# Altium schematic sheet PCB-MAIN.SchDoc
size 594 x 420 mm
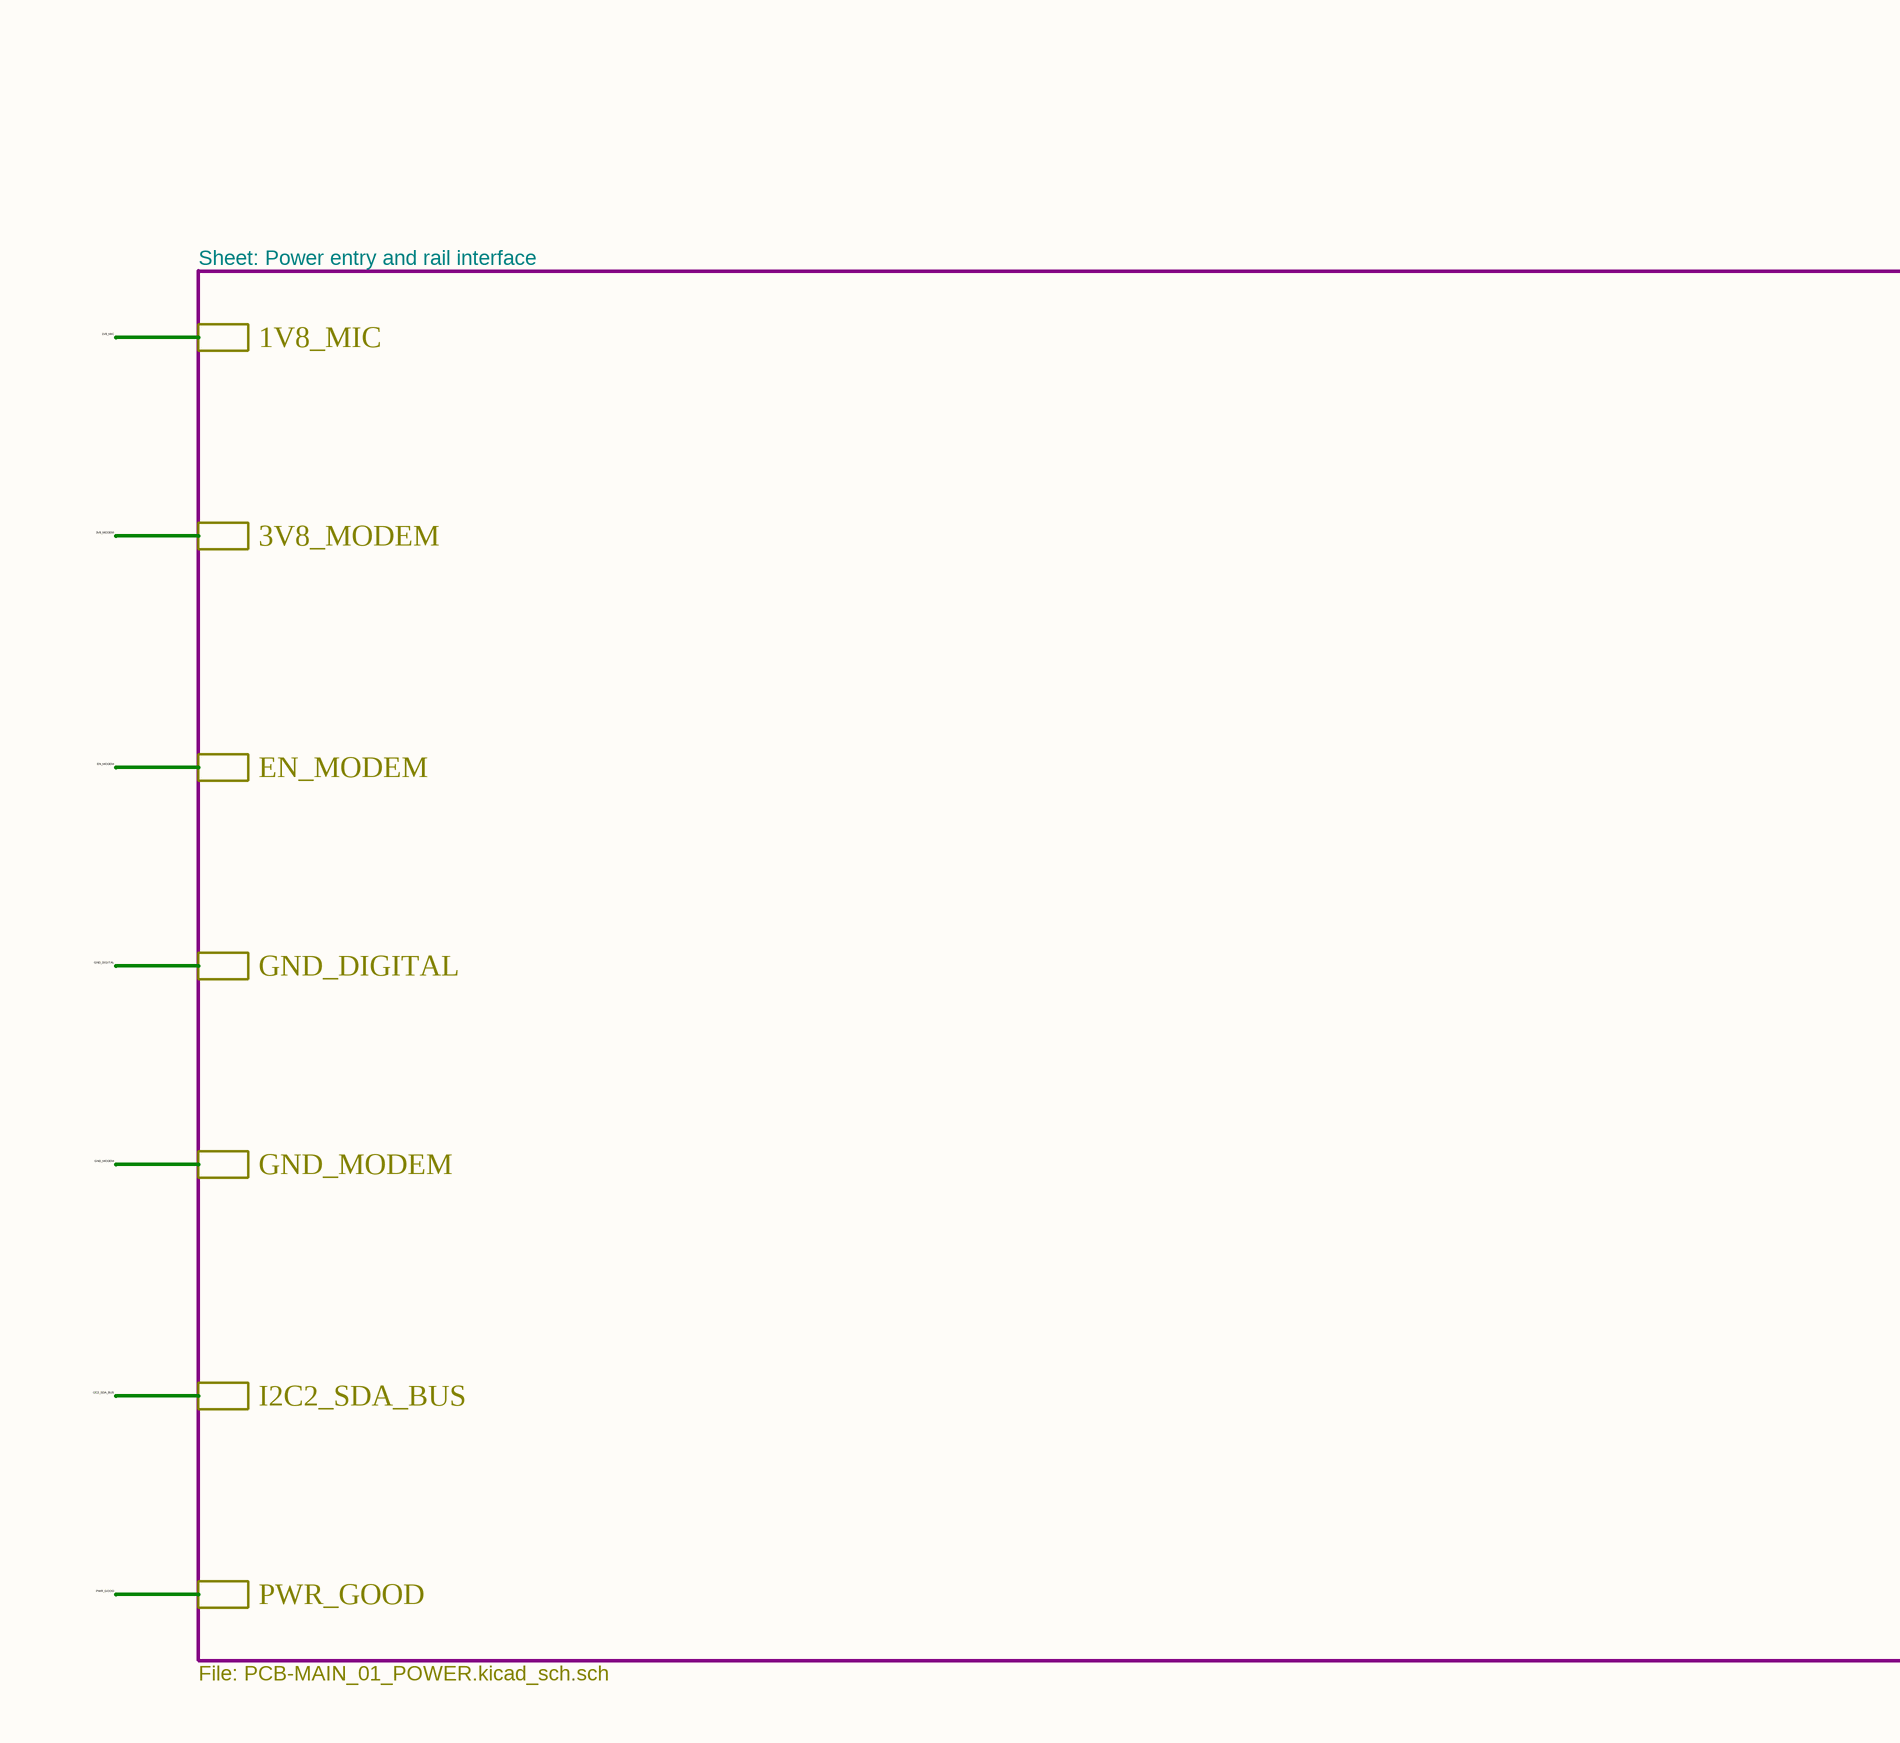
[diagram p0: PCB-MAIN.SchDoc, top column 1 of 4]
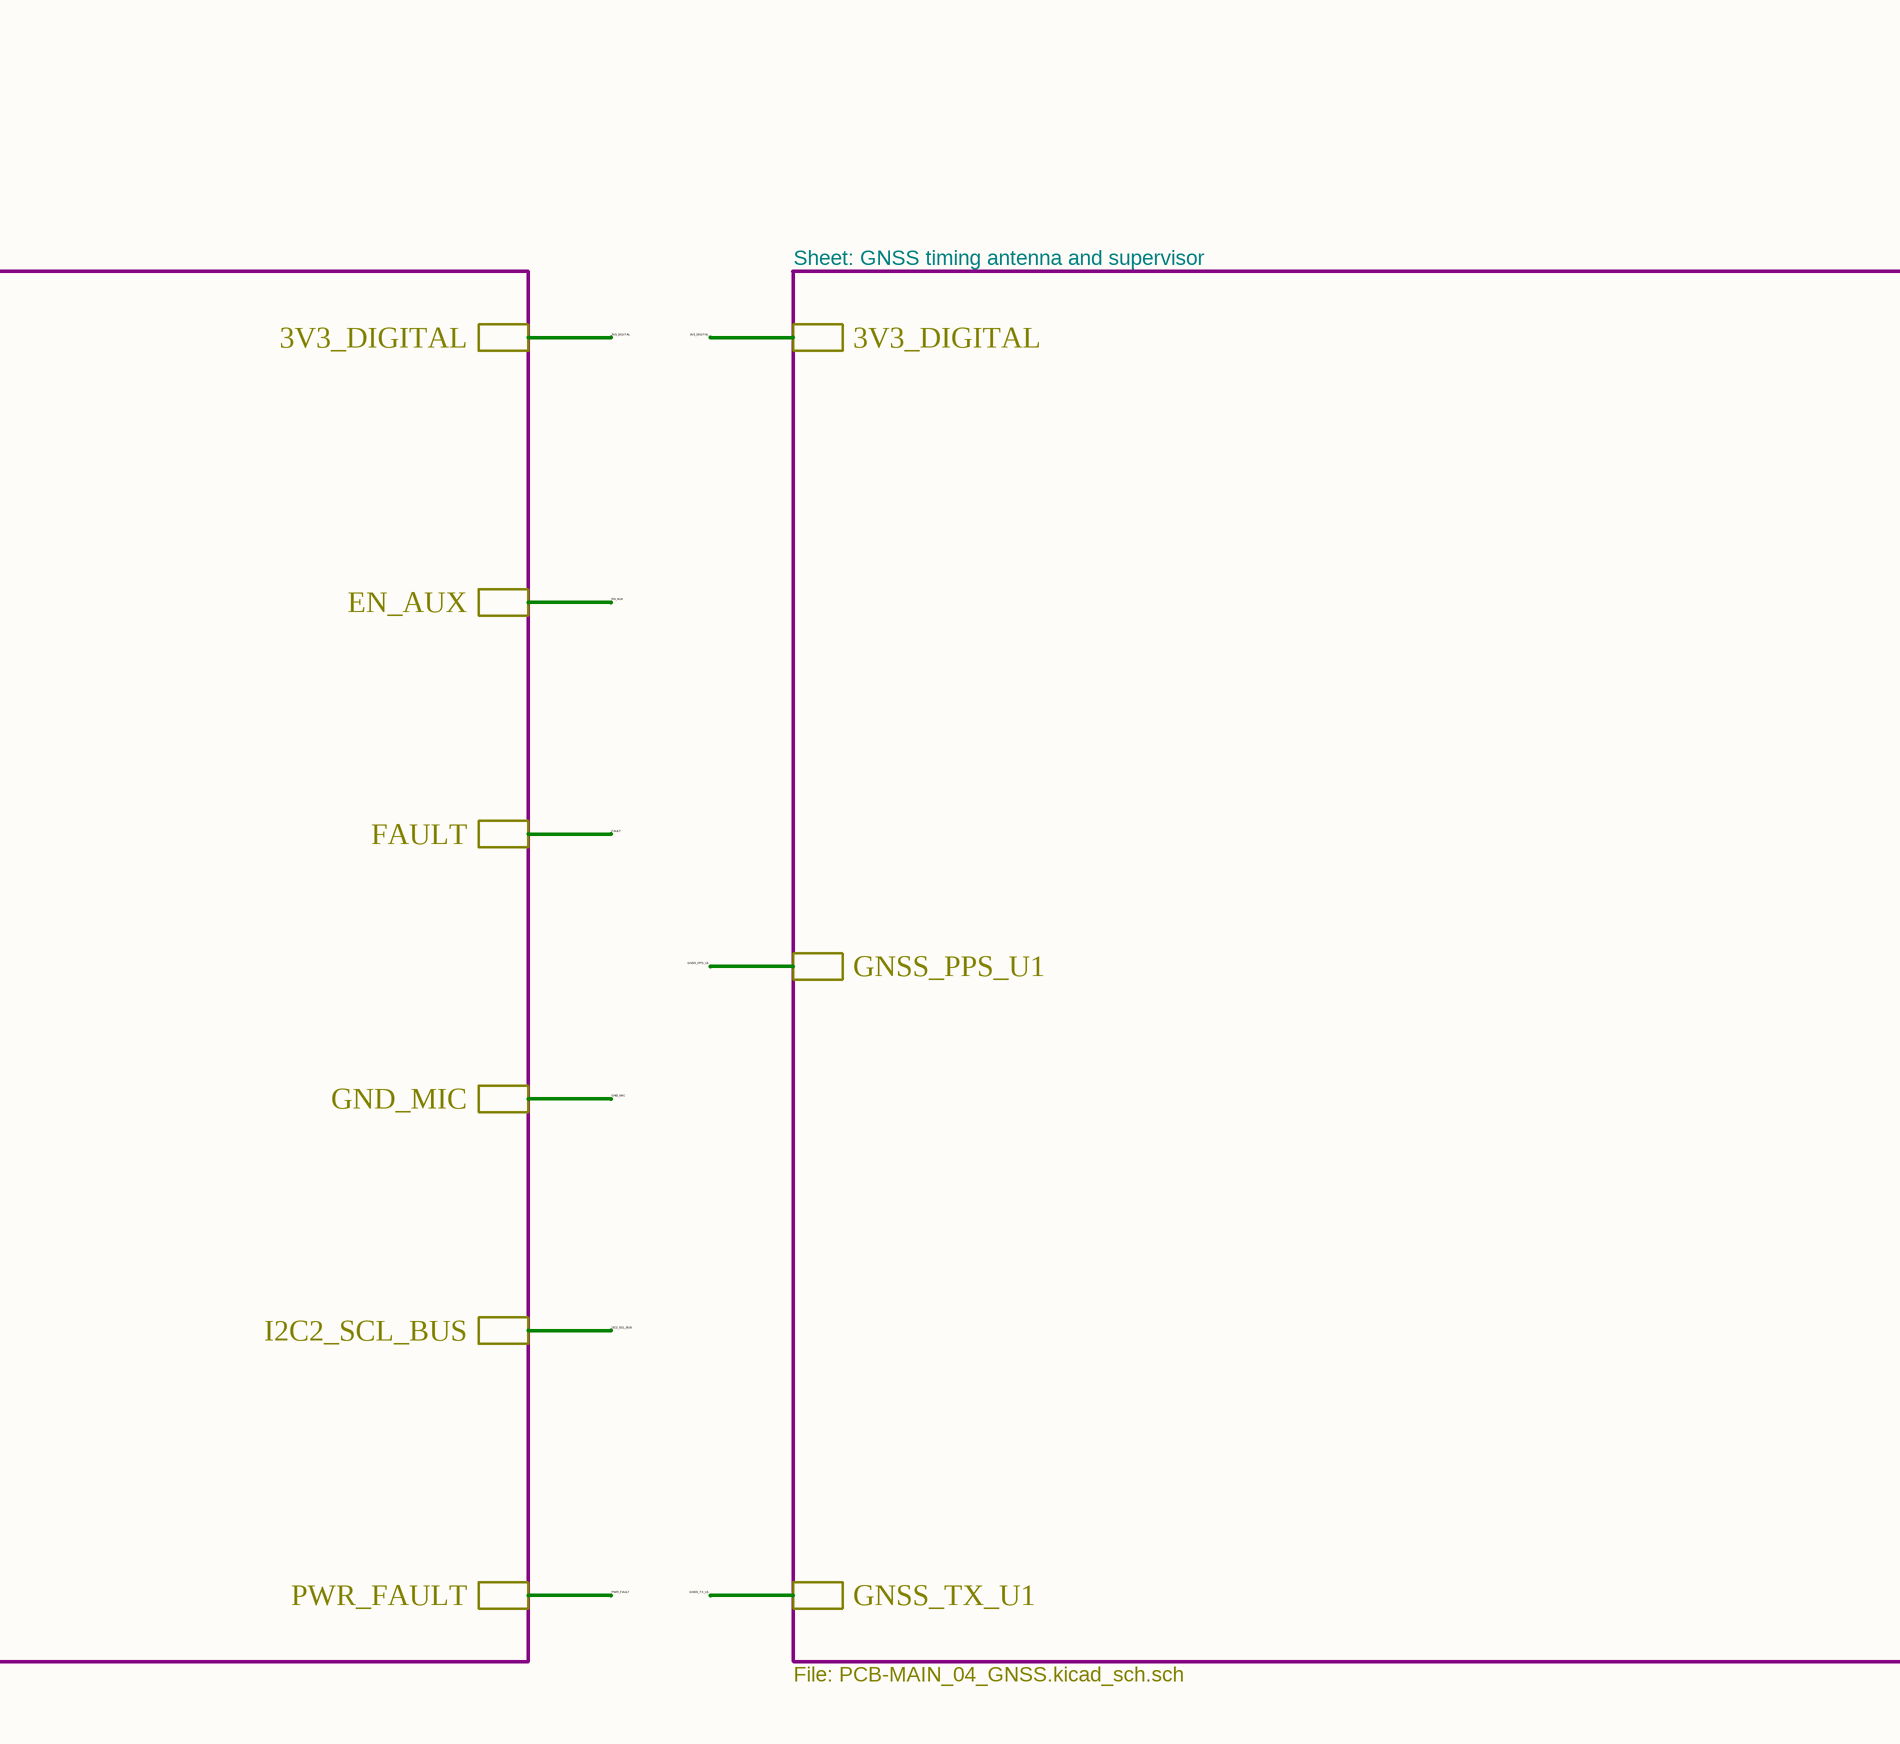
[diagram p1: PCB-MAIN.SchDoc, top column 2 of 4]
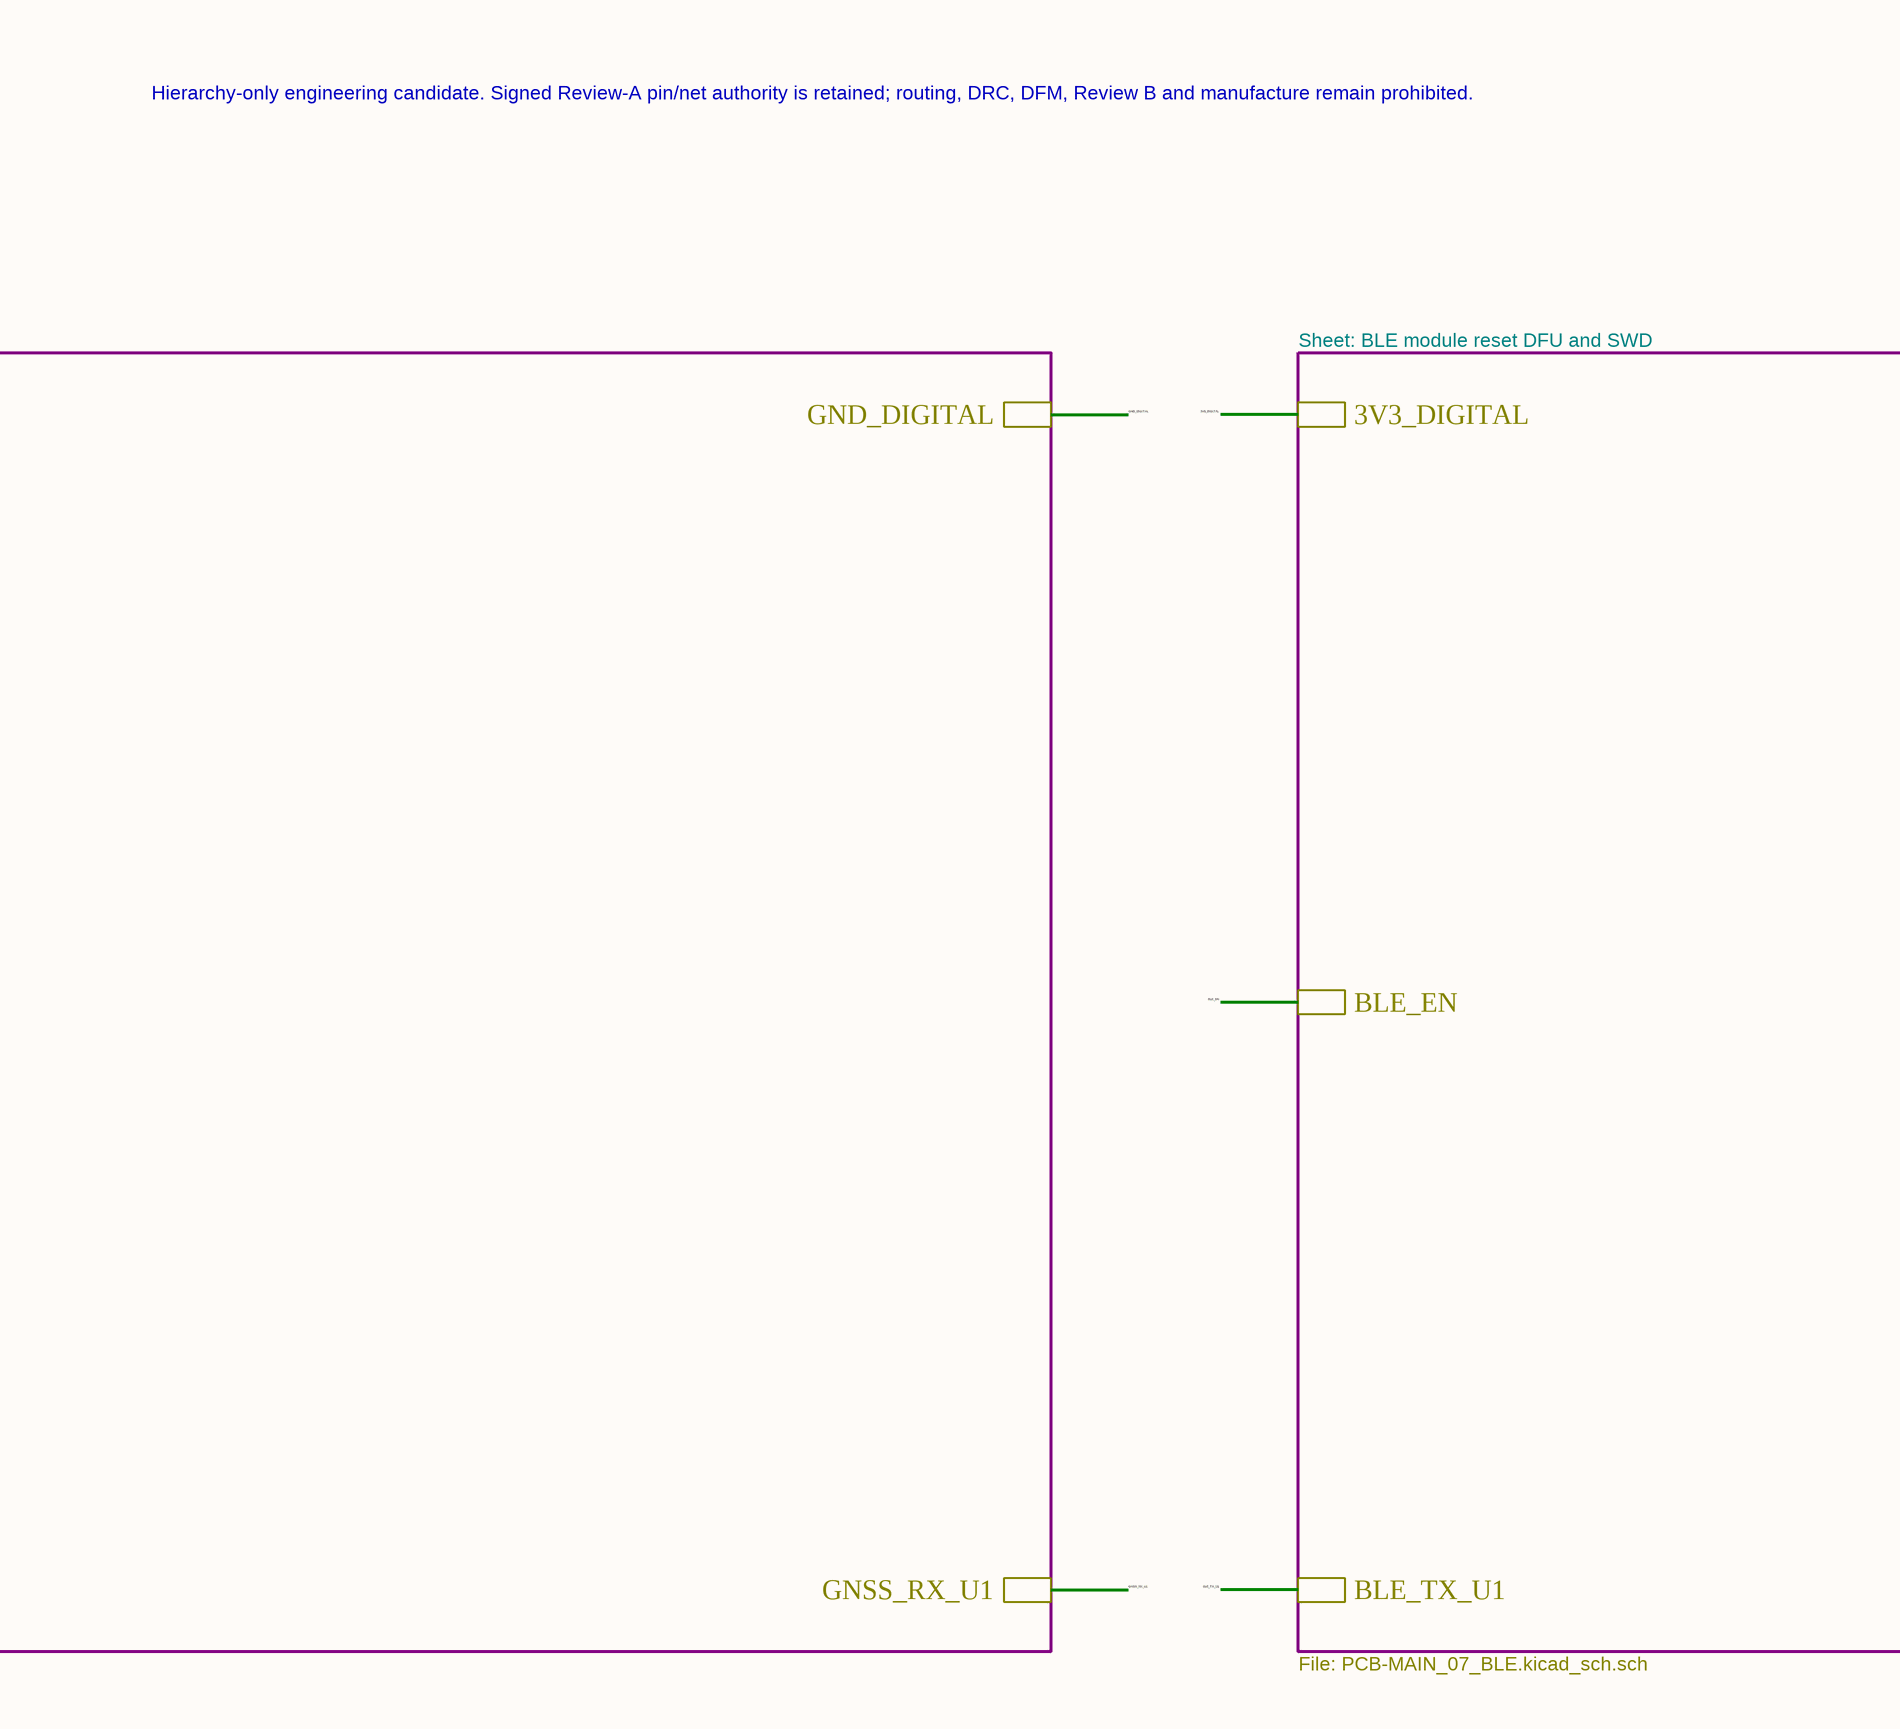
[diagram p2: PCB-MAIN.SchDoc, top column 3 of 4]
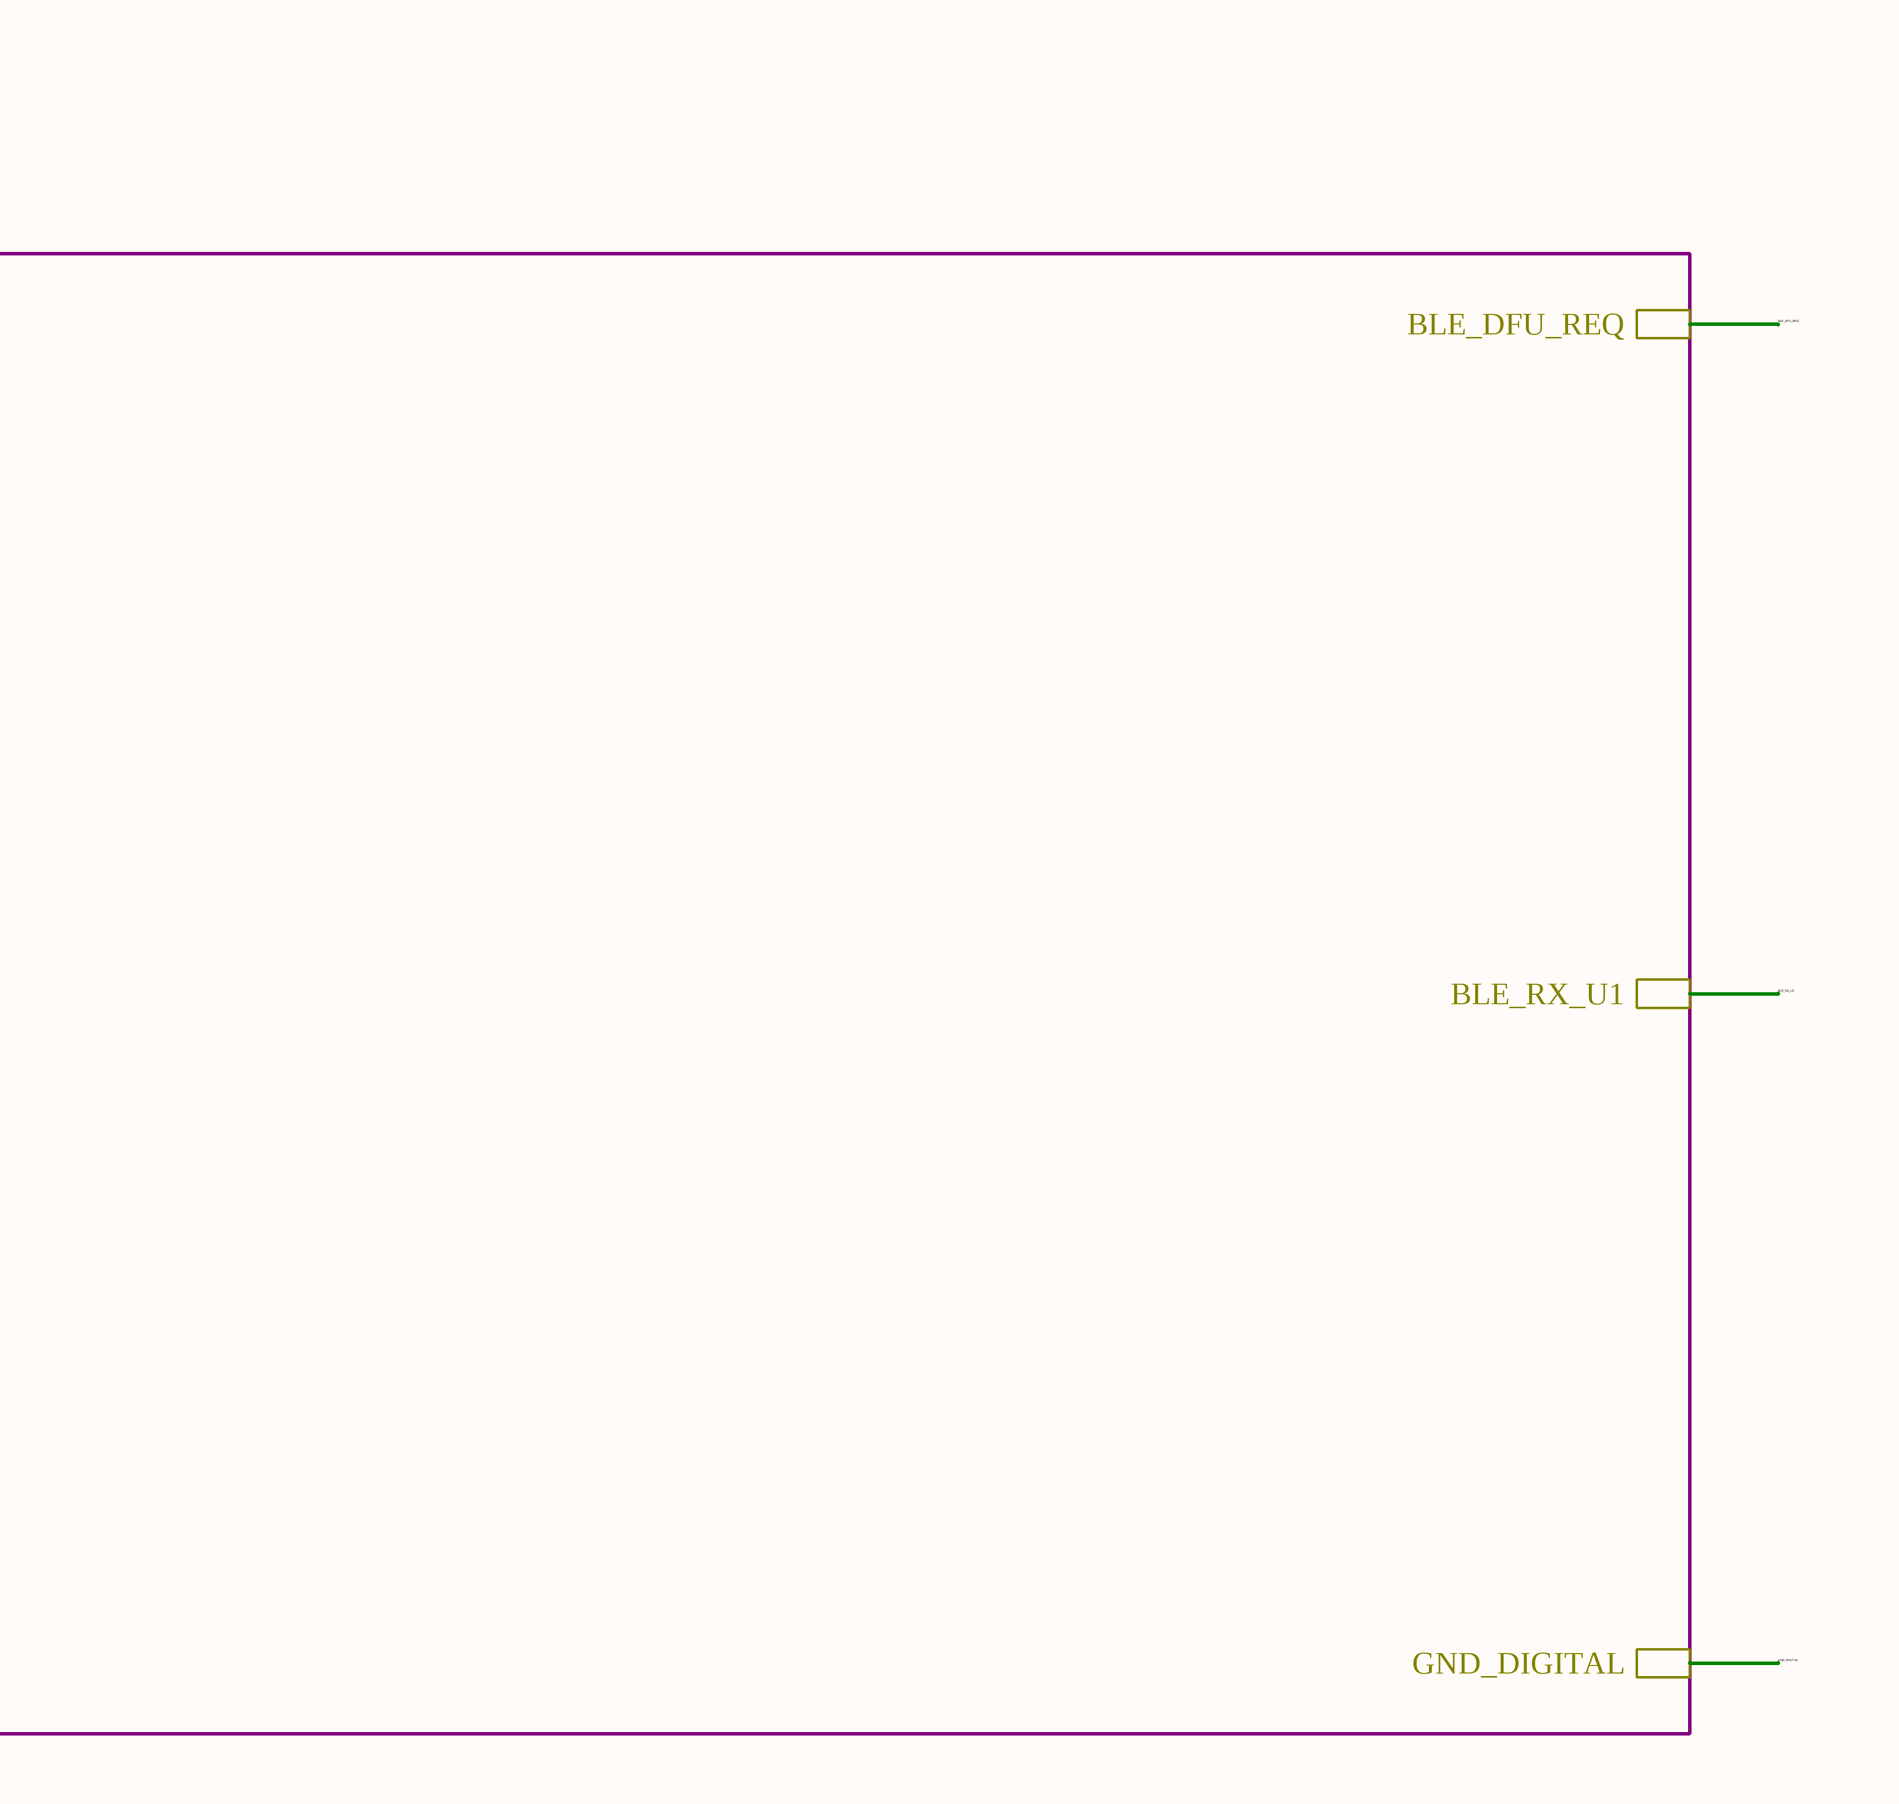
[diagram p3: PCB-MAIN.SchDoc, top column 4 of 4]
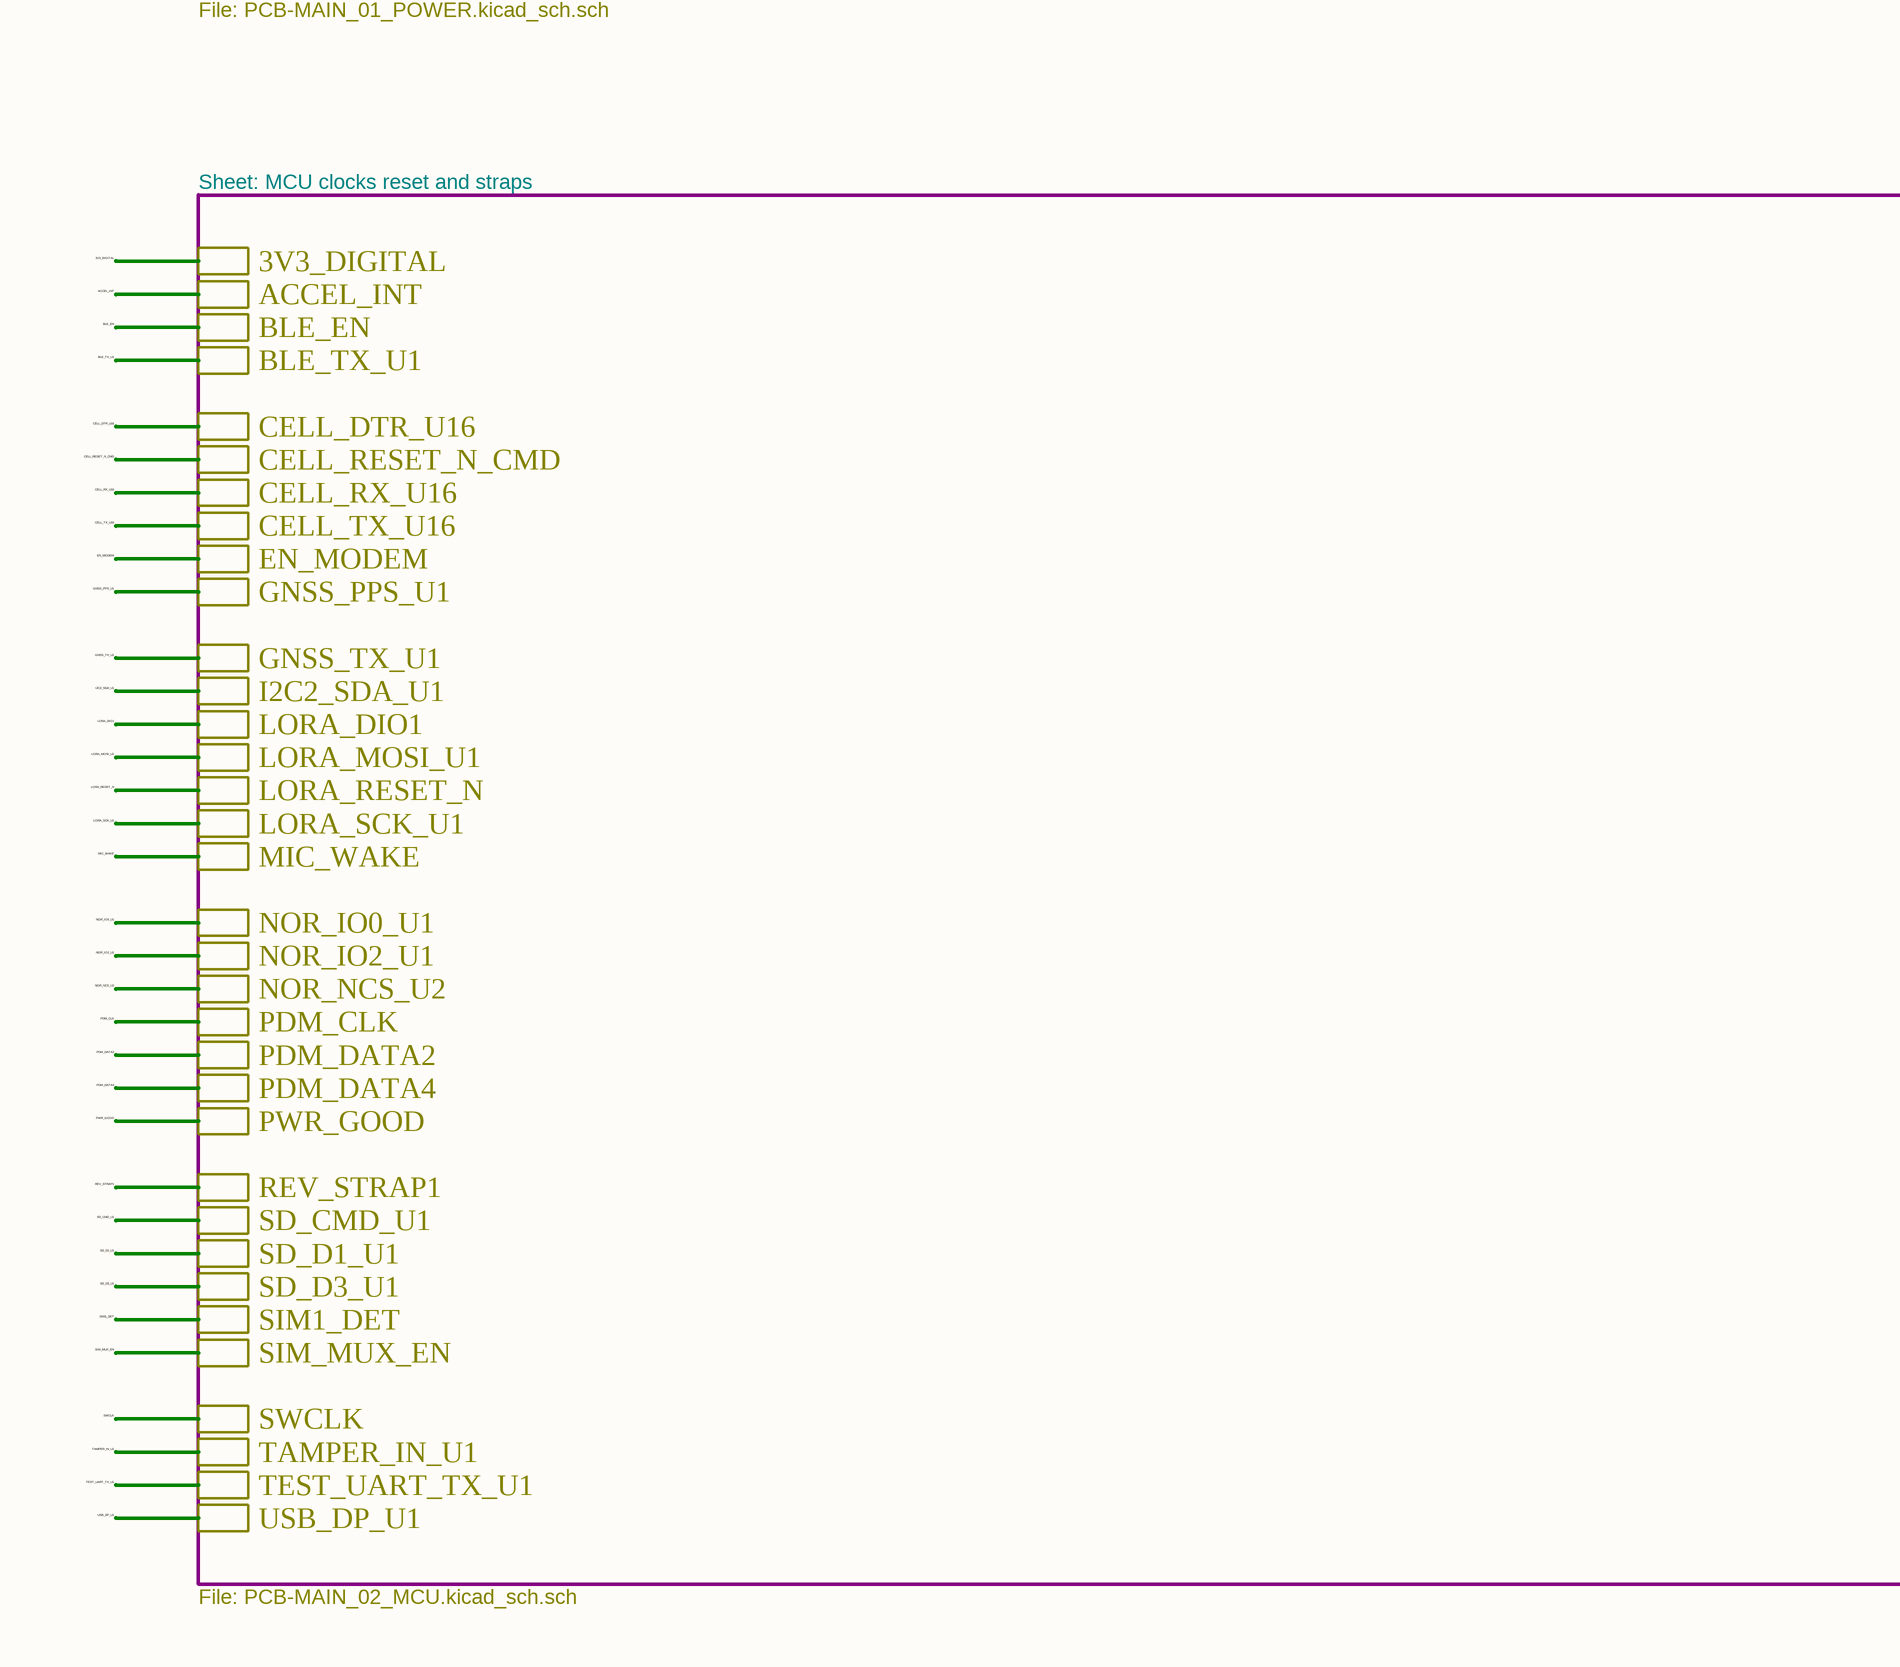
[diagram p4: PCB-MAIN.SchDoc, centre column 1 of 4]
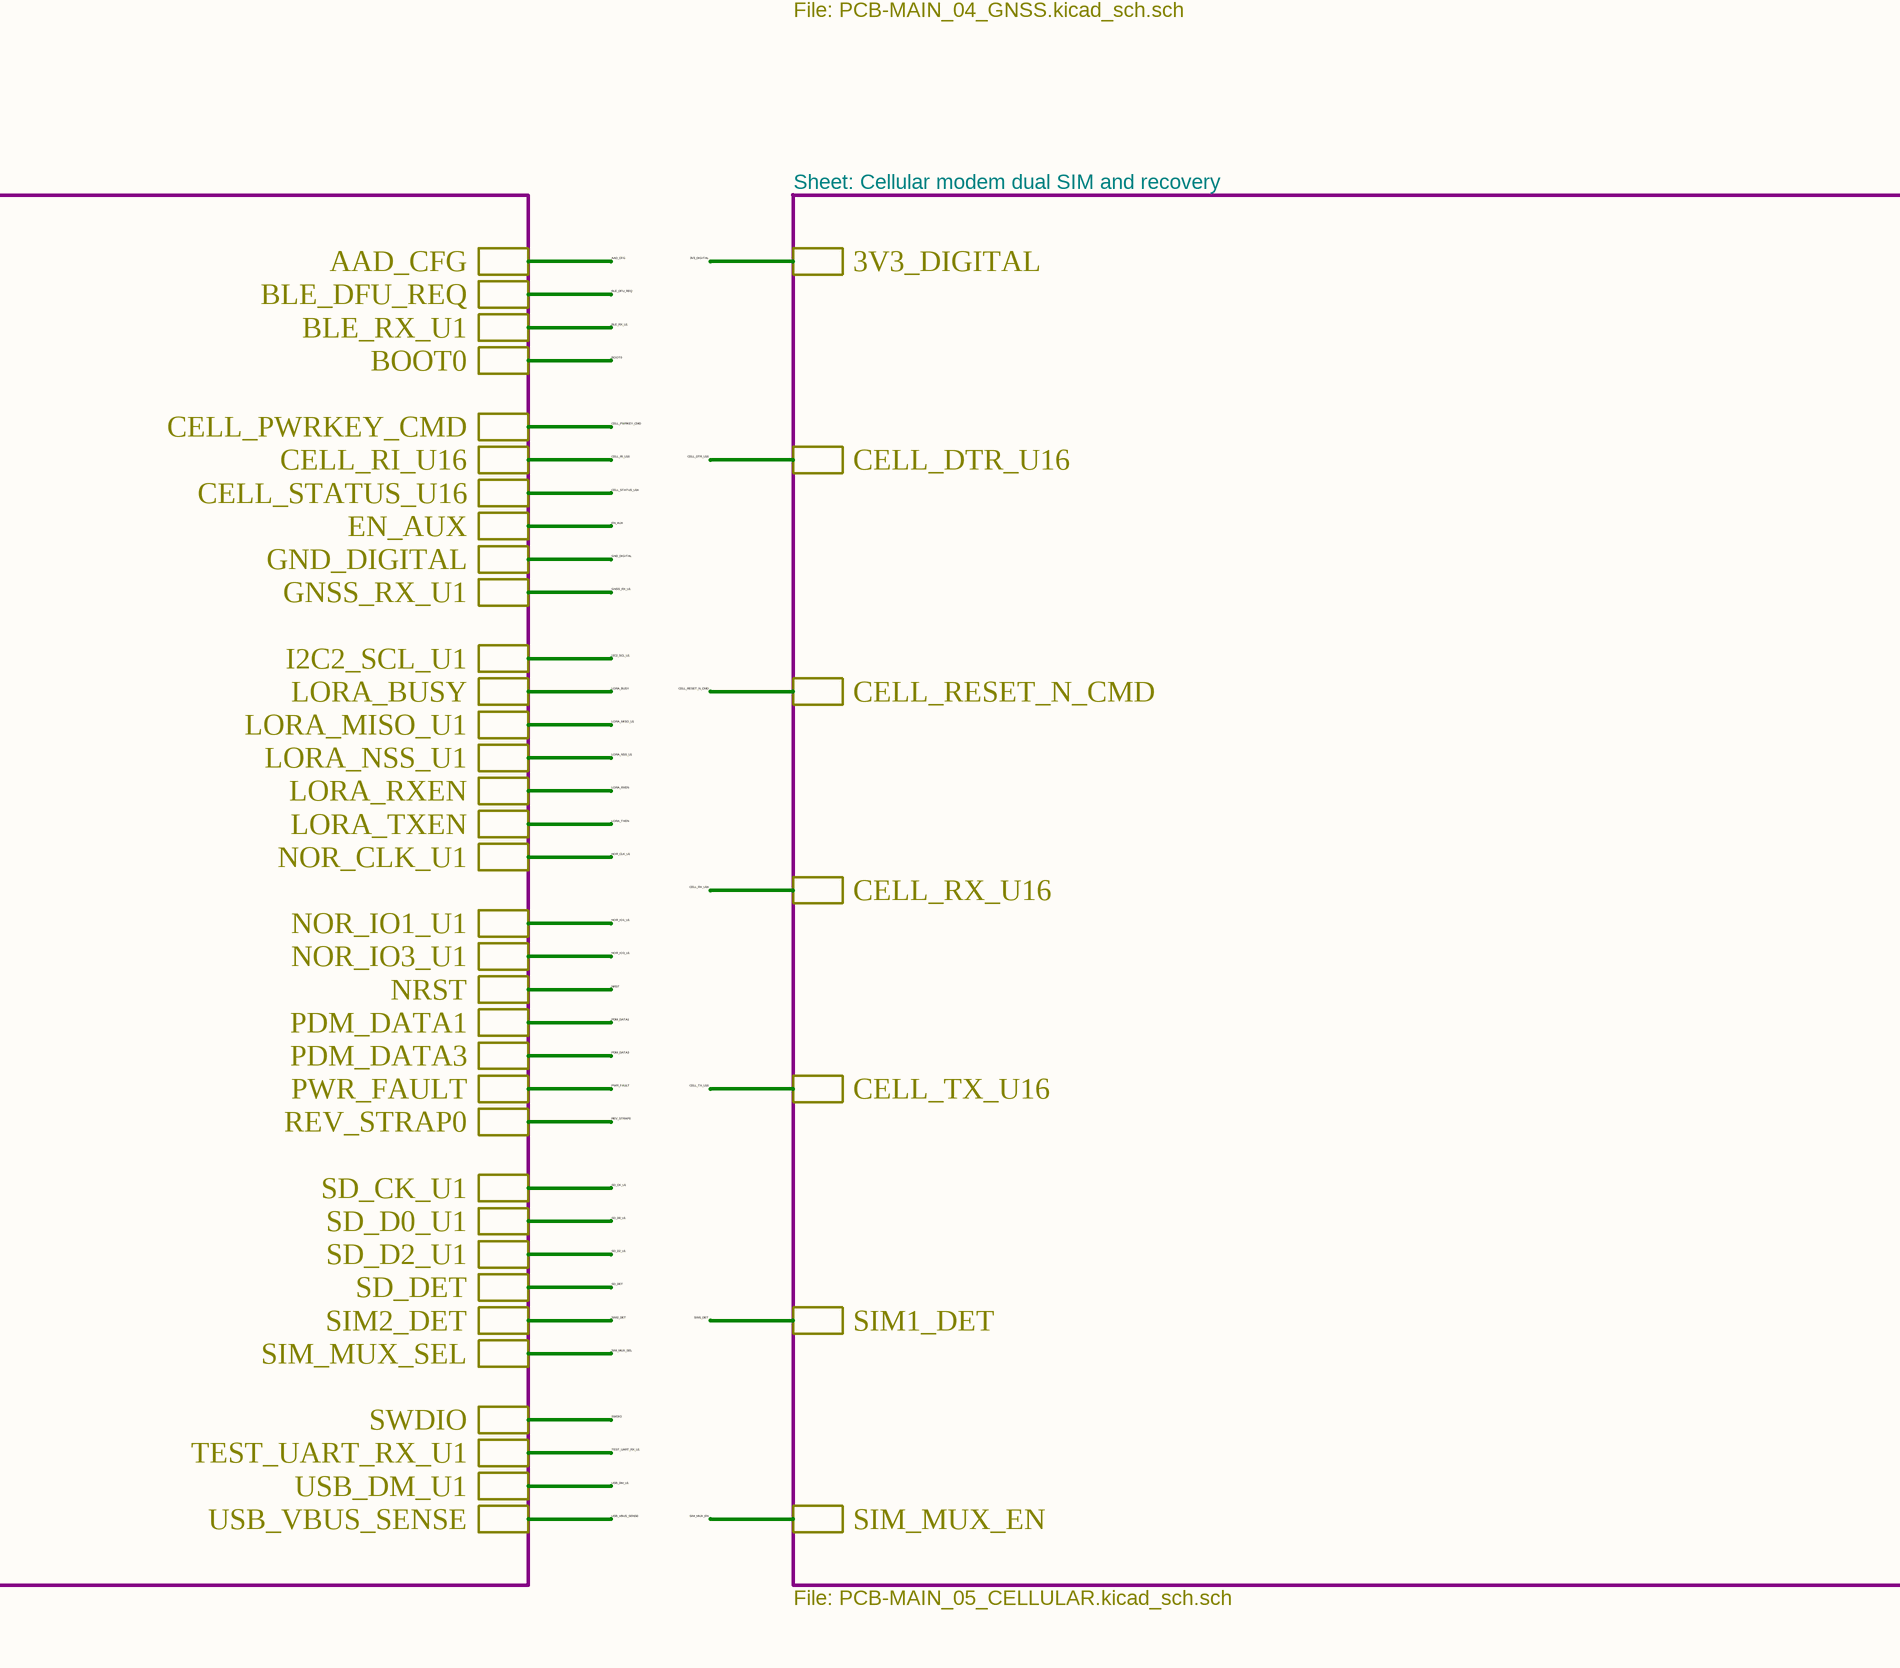
[diagram p5: PCB-MAIN.SchDoc, centre column 2 of 4]
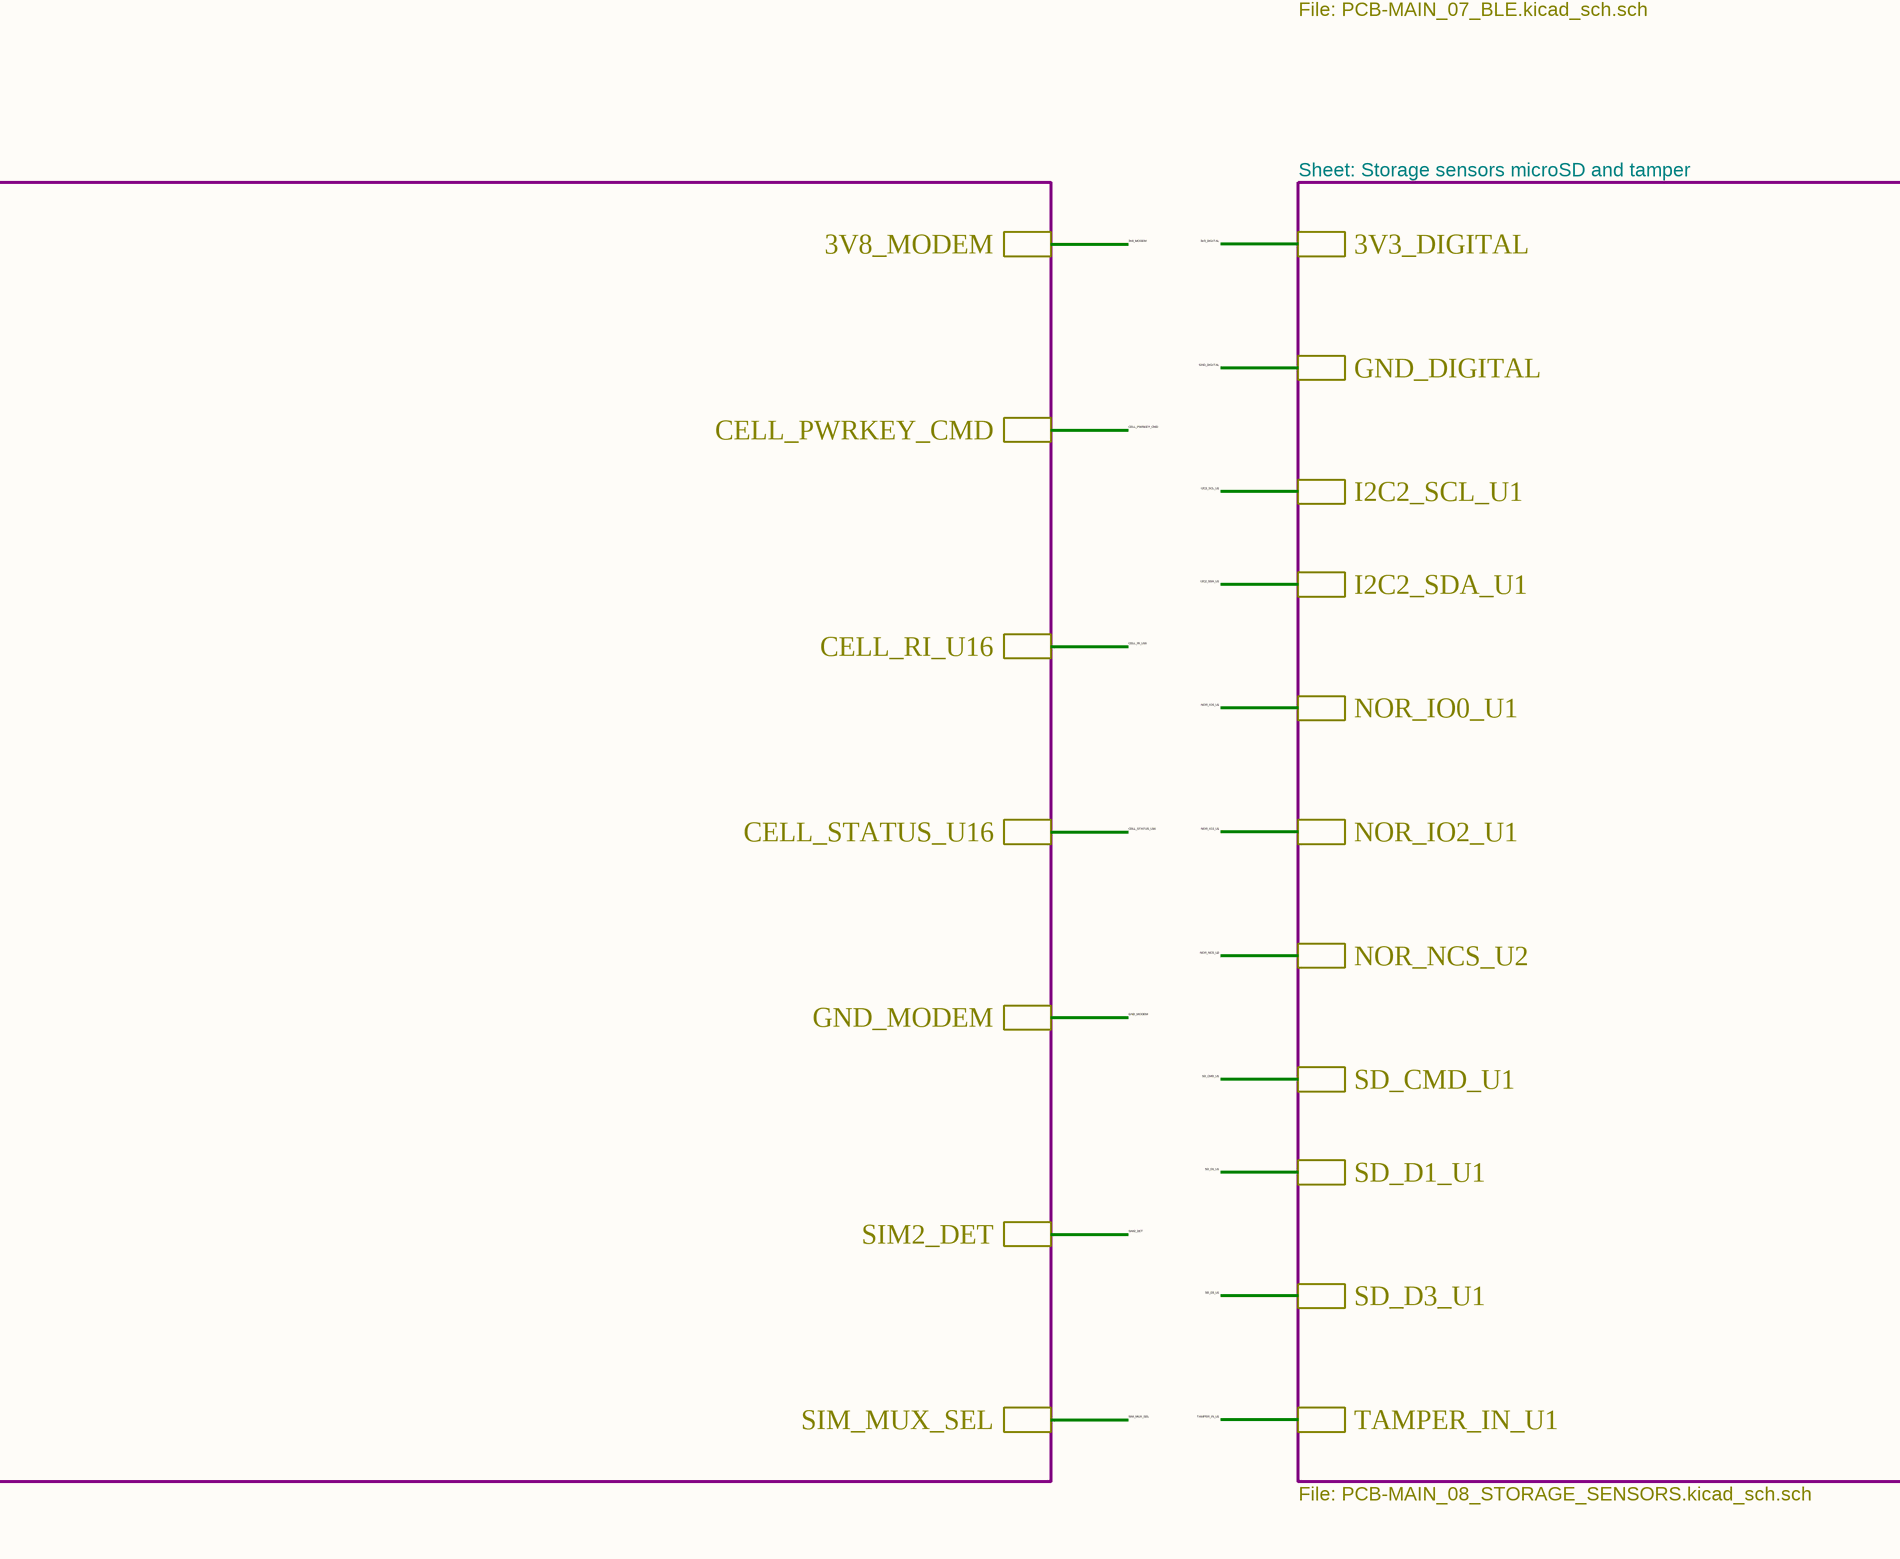
[diagram p6: PCB-MAIN.SchDoc, centre column 3 of 4]
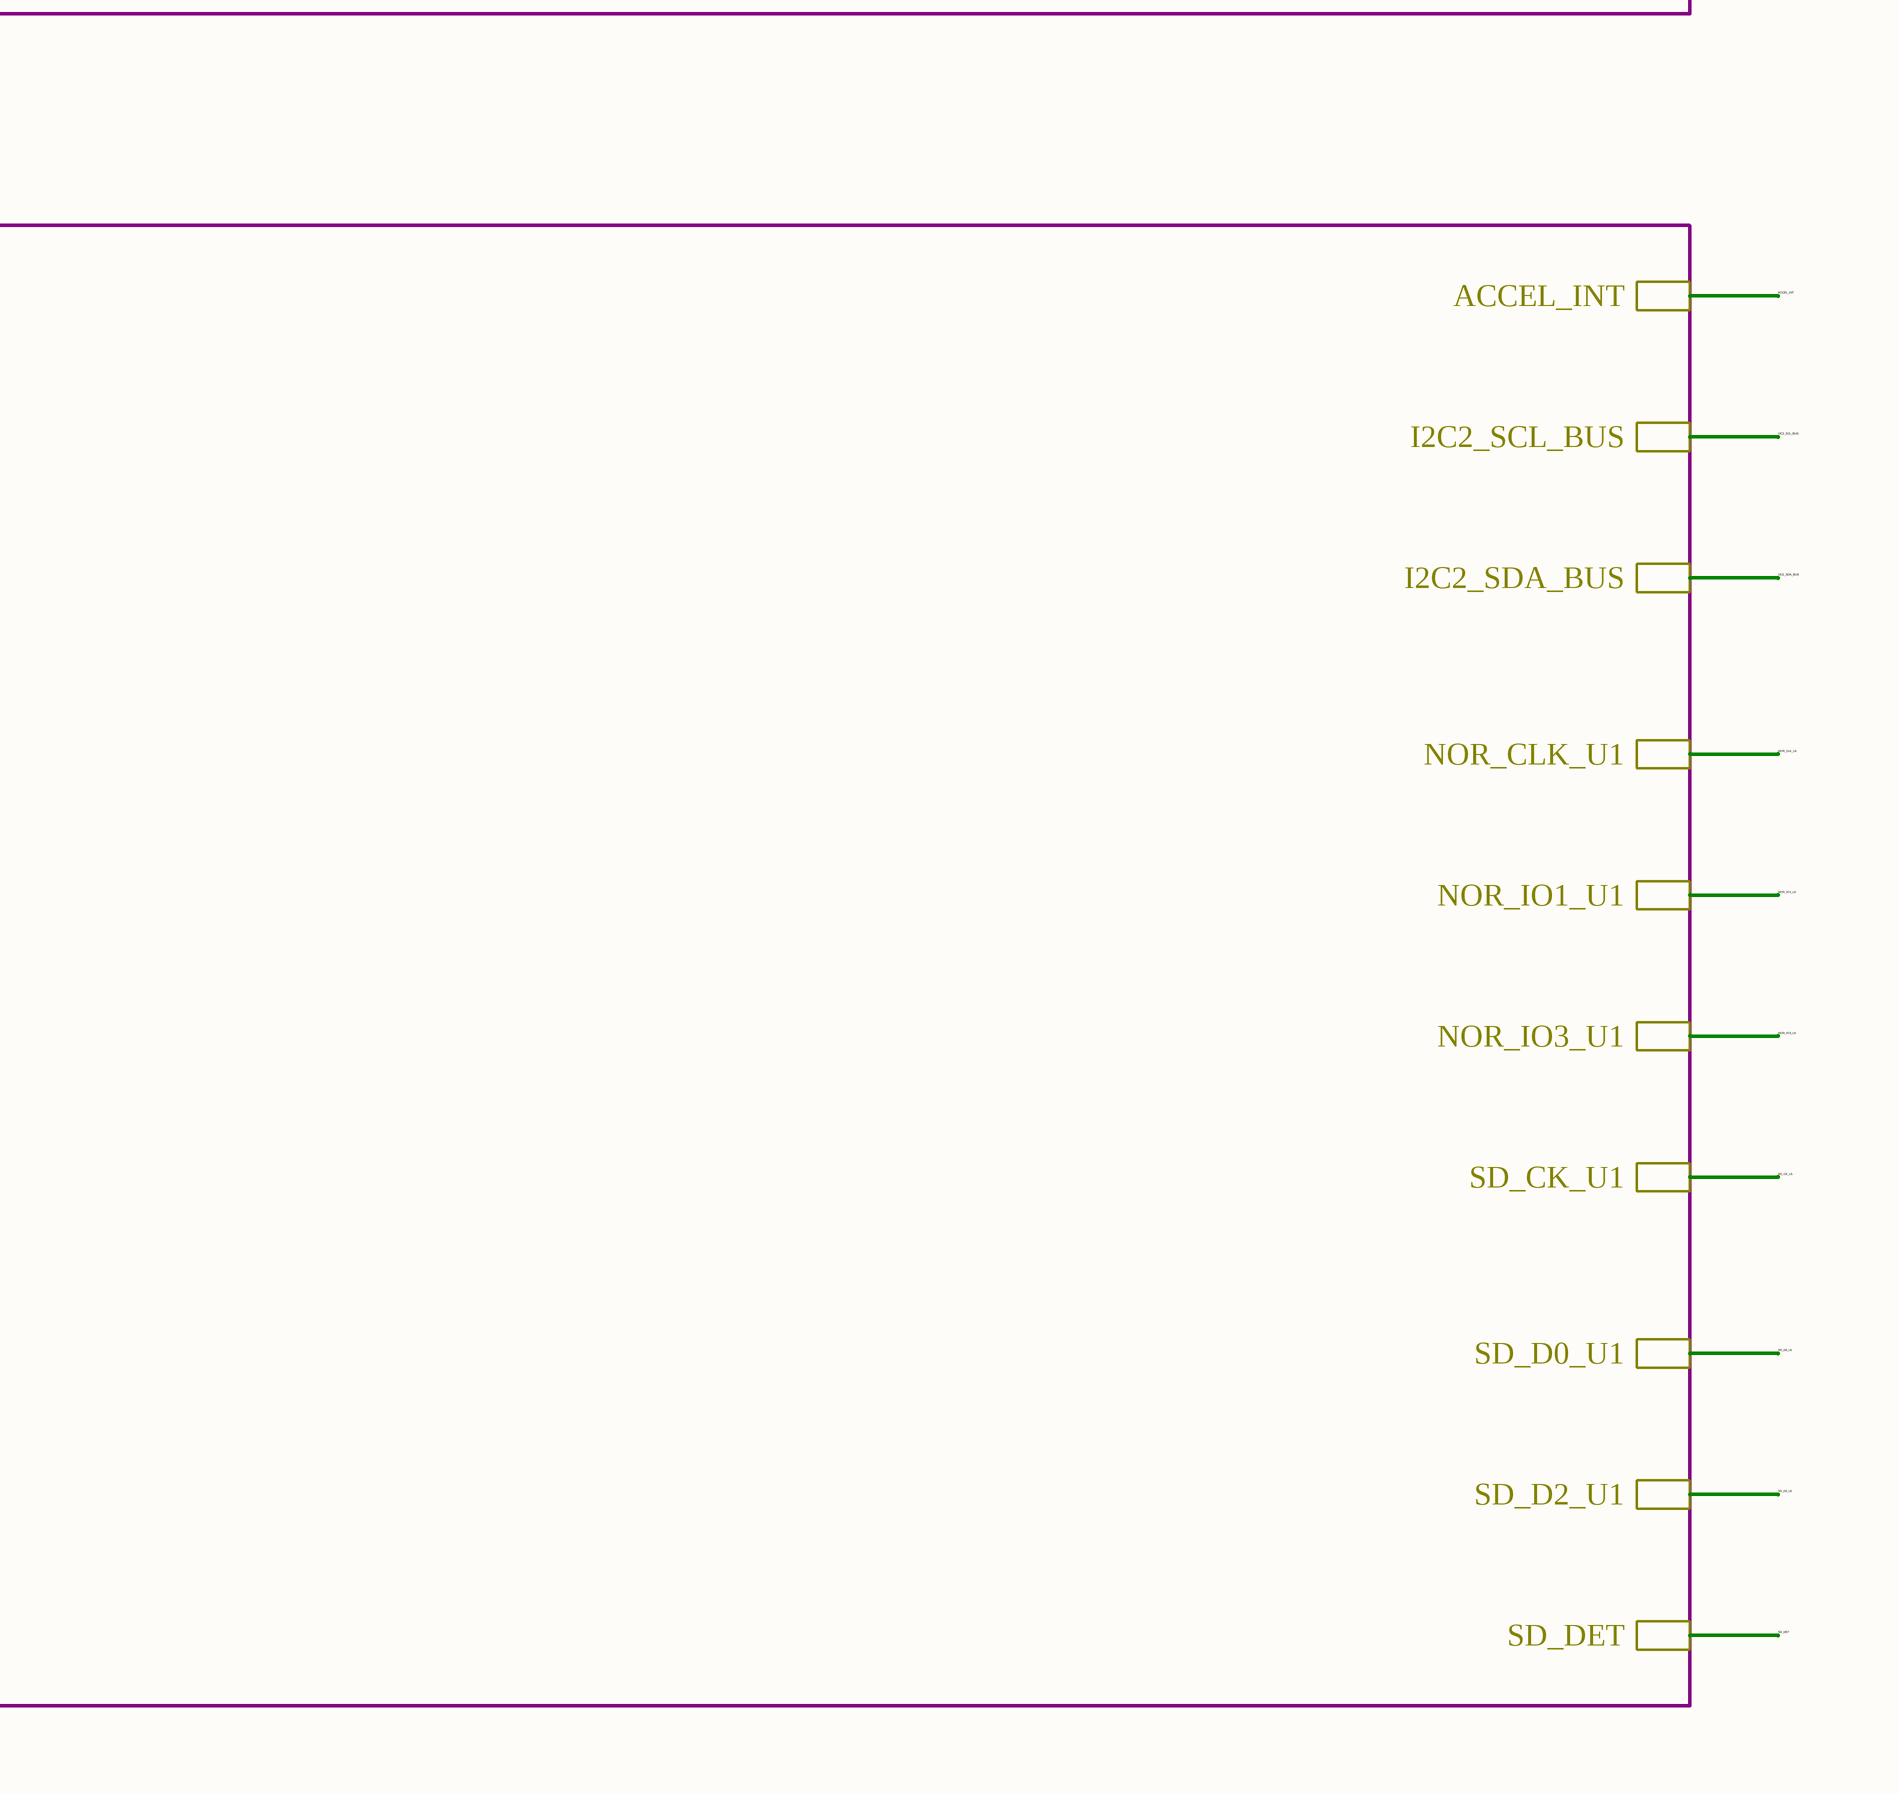
[diagram p7: PCB-MAIN.SchDoc, centre column 4 of 4]
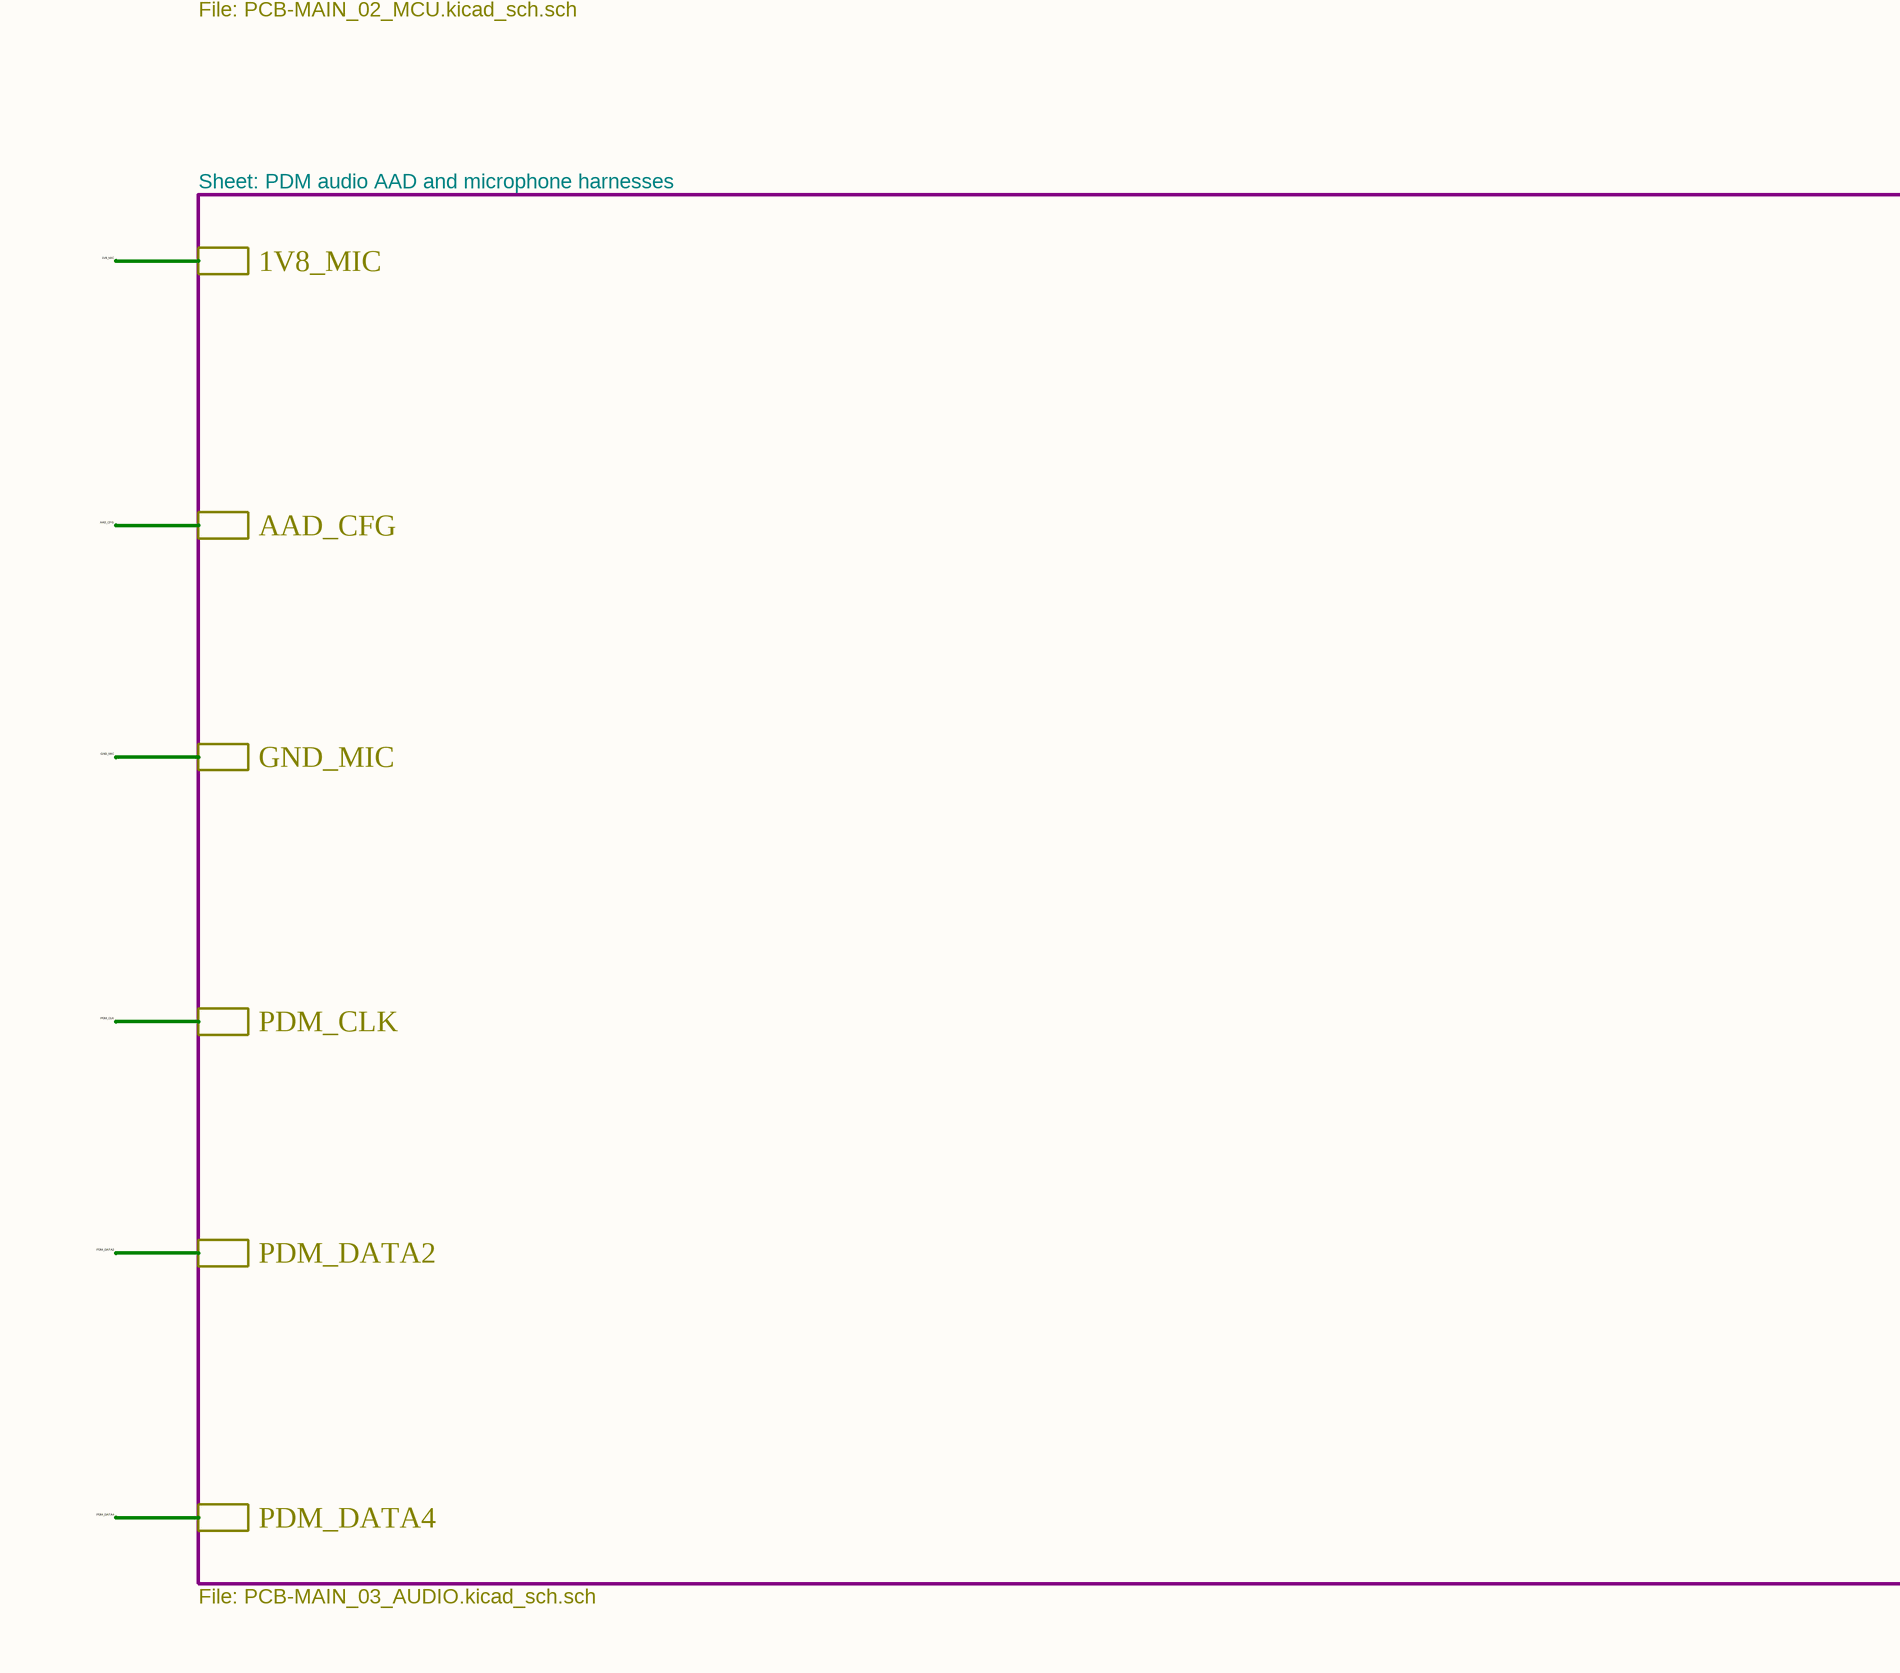
[diagram p8: PCB-MAIN.SchDoc, bottom column 1 of 4]
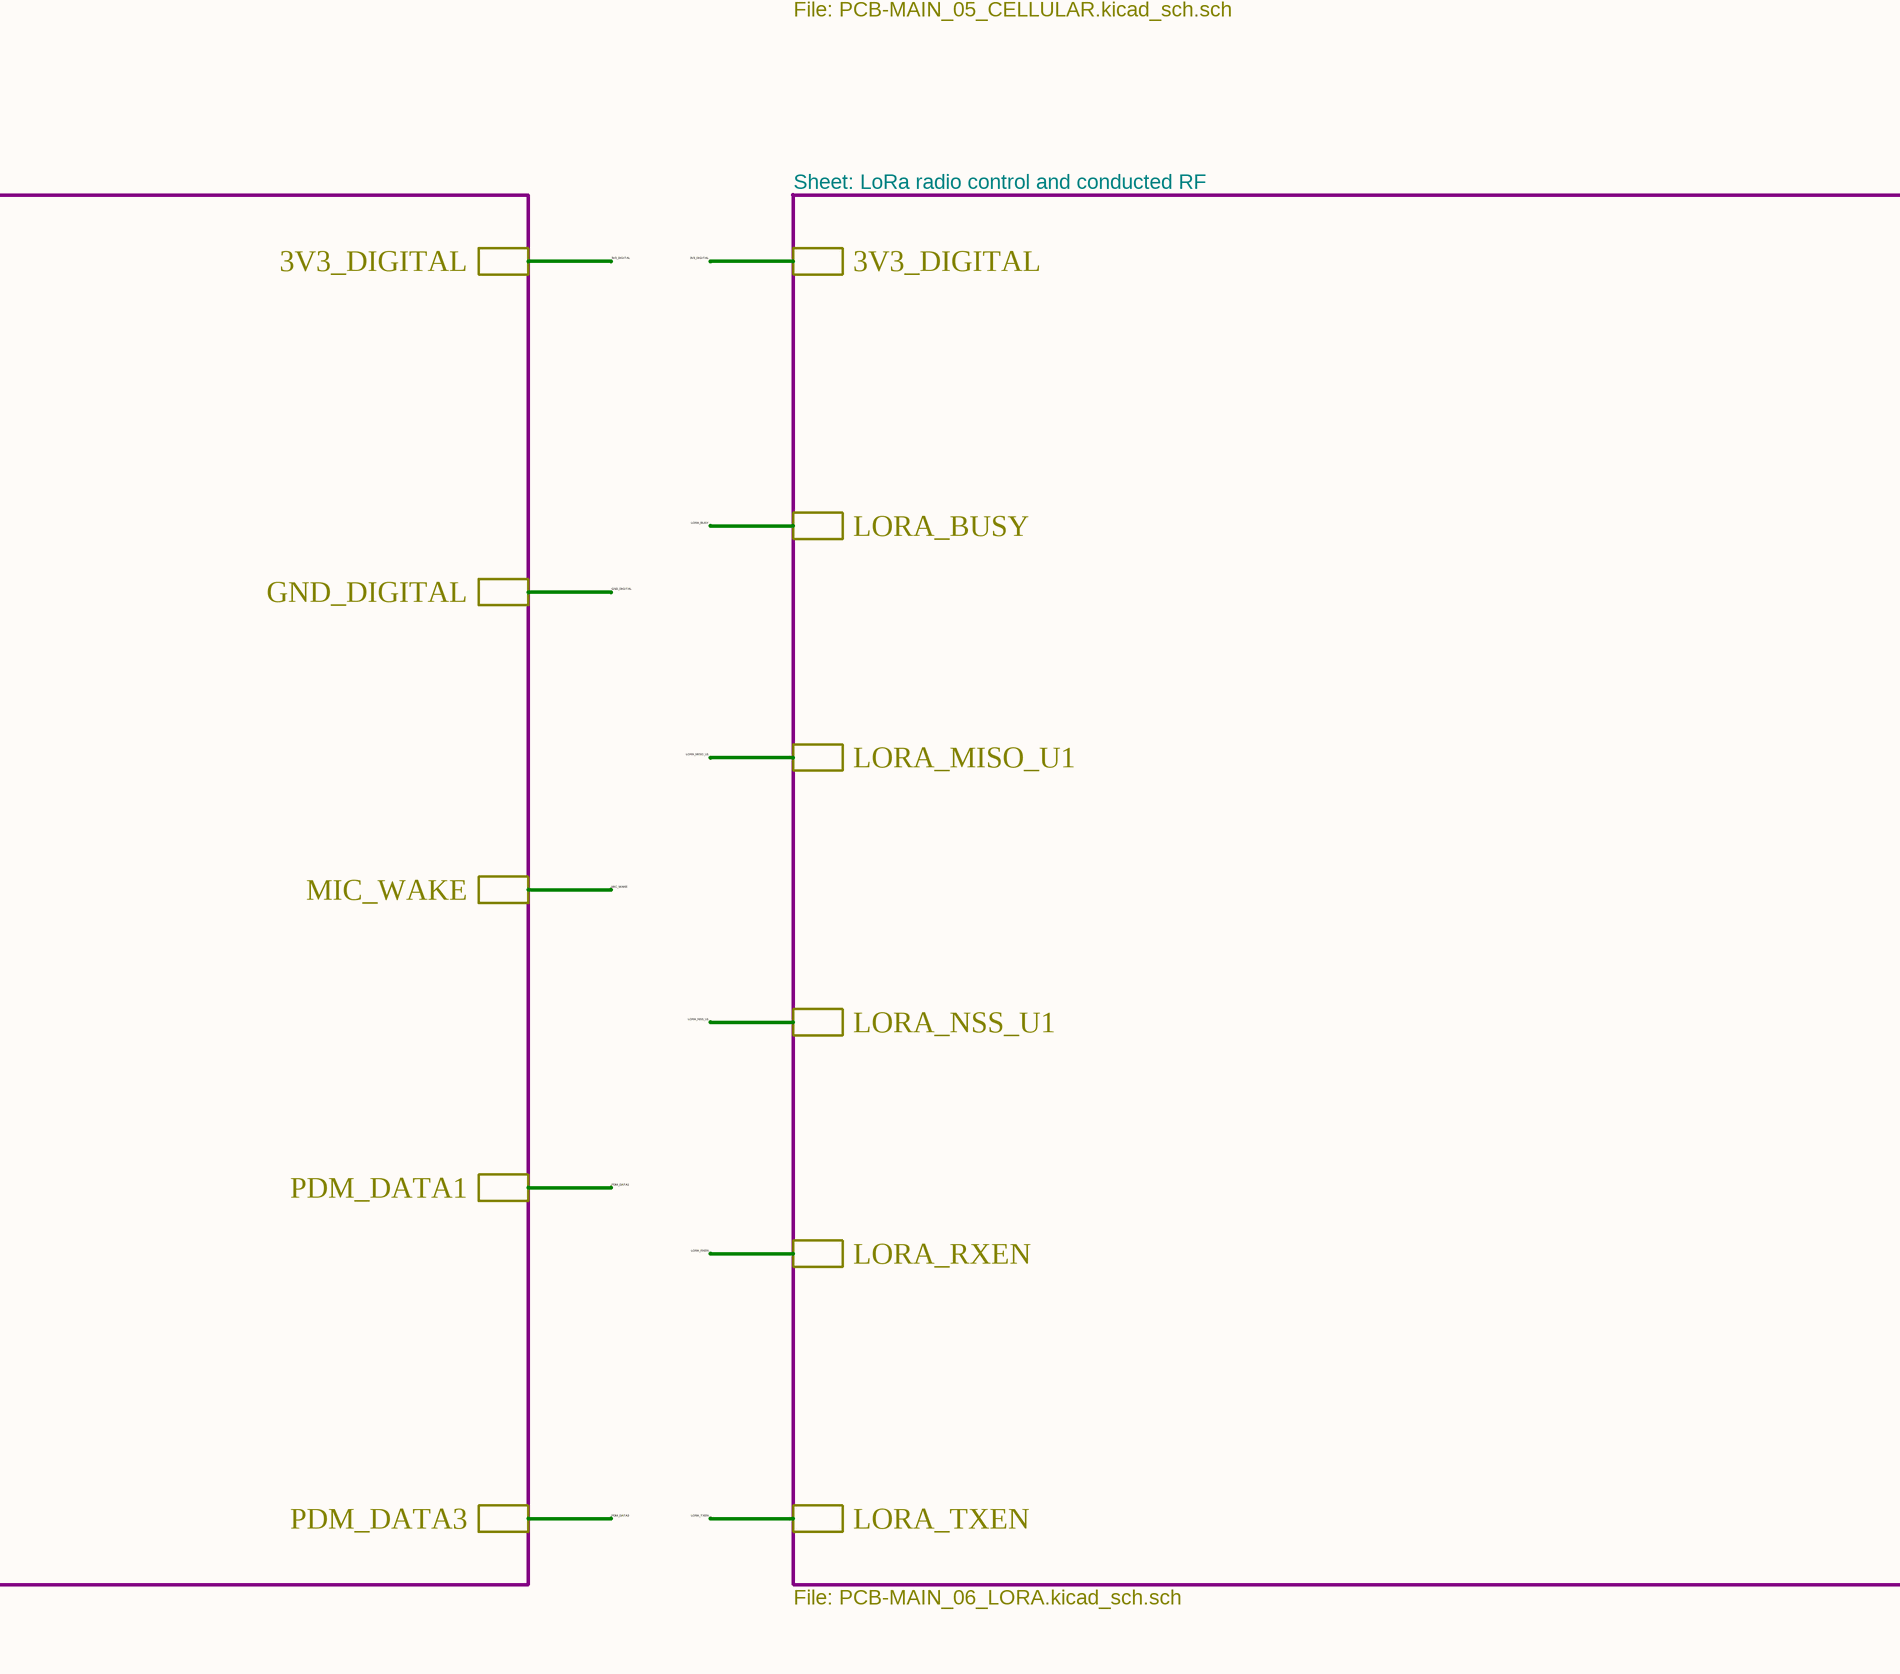
[diagram p9: PCB-MAIN.SchDoc, bottom column 2 of 4]
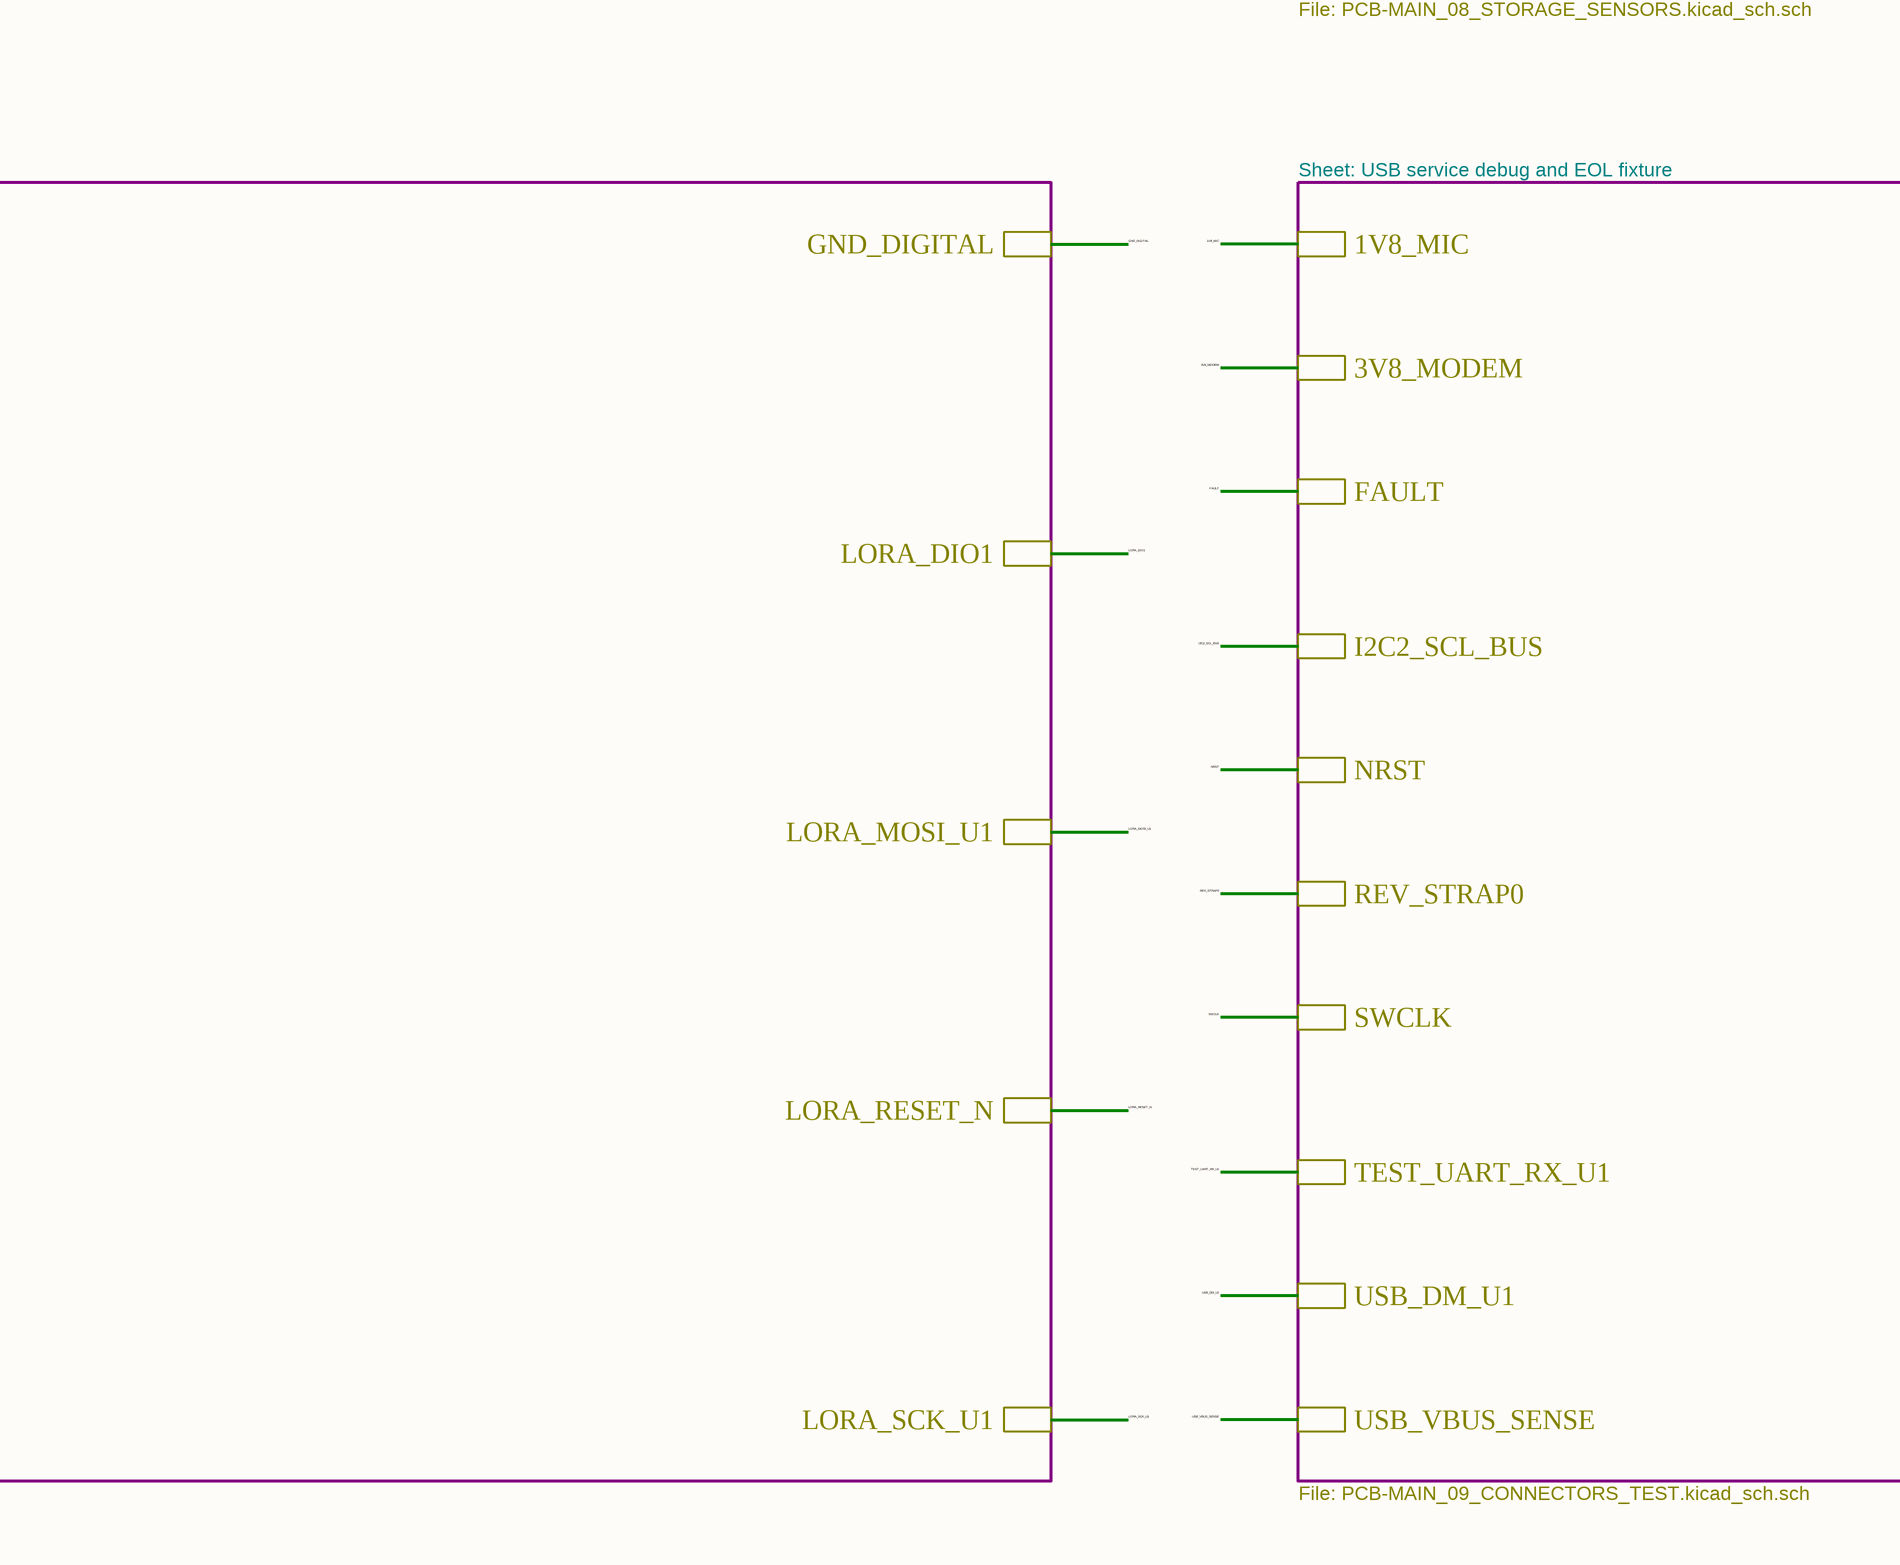
[diagram p10: PCB-MAIN.SchDoc, bottom column 3 of 4]
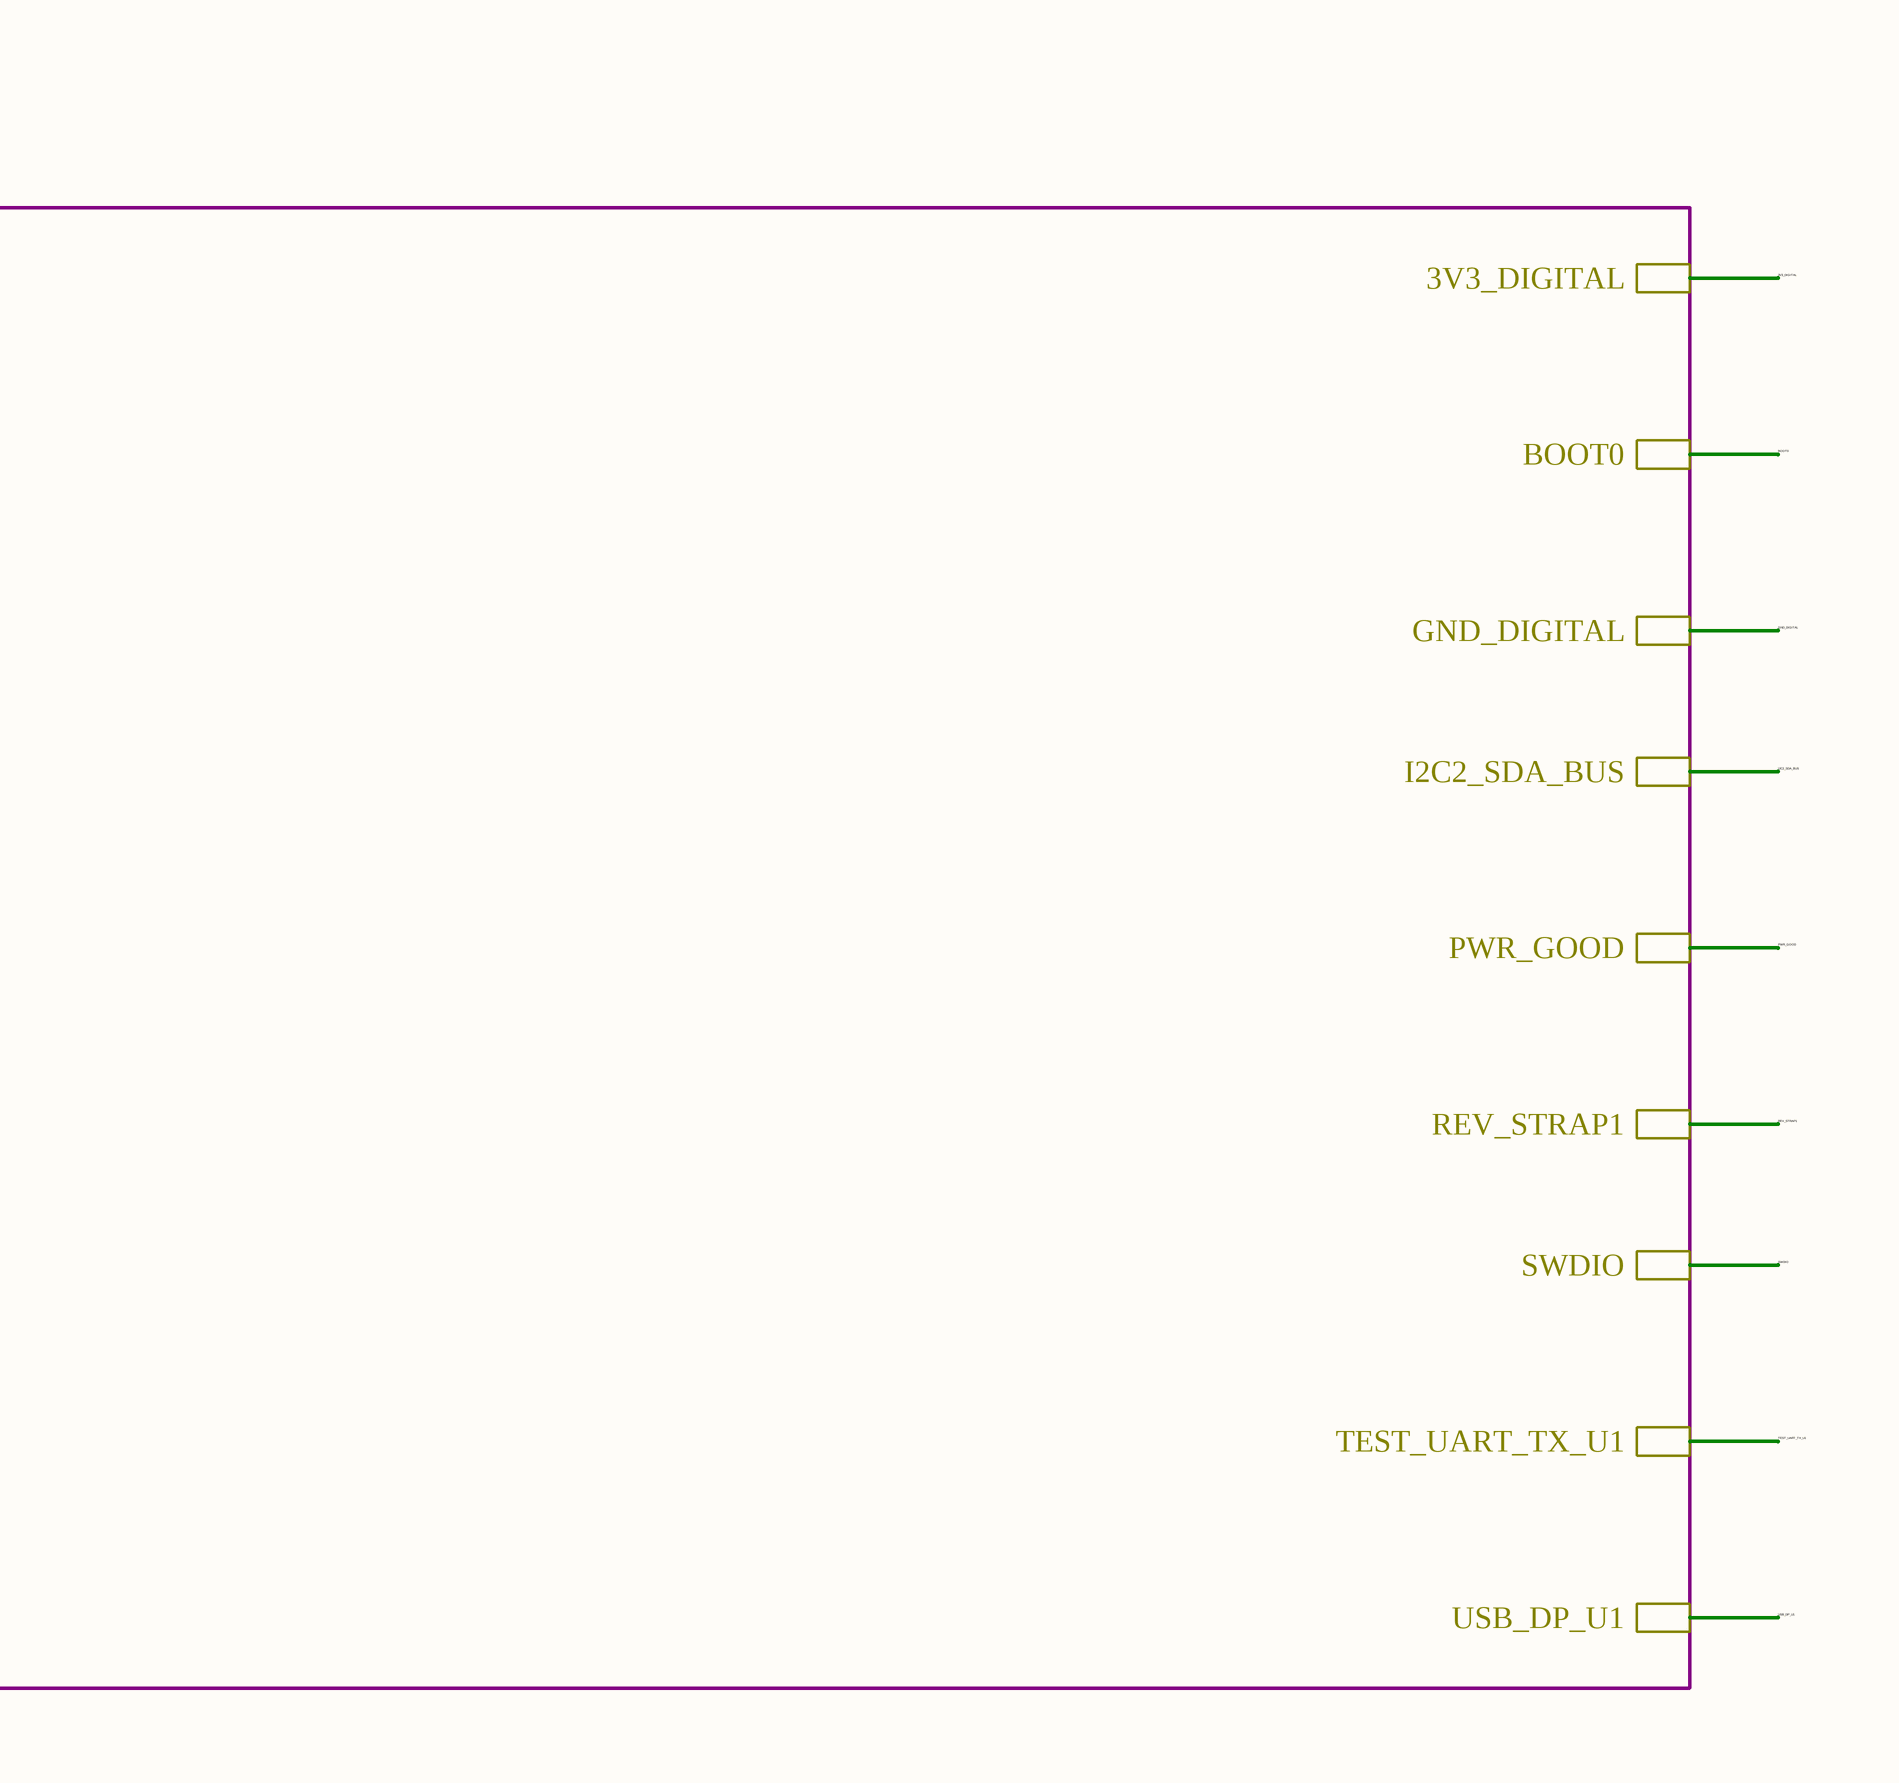
[diagram p11: PCB-MAIN.SchDoc, bottom column 4 of 4]

## Sub-sheets
BLE module reset DFU and SWD = PCB-MAIN_07_BLE.SchDoc: 3V3_DIGITAL, BLE_EN, BLE_TX_U1, BLE_DFU_REQ, BLE_RX_U1, GND_DIGITAL
Cellular modem dual SIM and recovery = PCB-MAIN_05_CELLULAR.SchDoc: 3V3_DIGITAL, CELL_DTR_U16, CELL_RESET_N_CMD, CELL_RX_U16, CELL_TX_U16, SIM1_DET, SIM_MUX_EN, 3V8_MODEM, CELL_PWRKEY_CMD, CELL_RI_U16, CELL_STATUS_U16, GND_MODEM, SIM2_DET, SIM_MUX_SEL
GNSS timing antenna and supervisor = PCB-MAIN_04_GNSS.SchDoc: 3V3_DIGITAL, GNSS_PPS_U1, GNSS_TX_U1, GND_DIGITAL, GNSS_RX_U1
LoRa radio control and conducted RF = PCB-MAIN_06_LORA.SchDoc: 3V3_DIGITAL, LORA_BUSY, LORA_MISO_U1, LORA_NSS_U1, LORA_RXEN, LORA_TXEN, GND_DIGITAL, LORA_DIO1, LORA_MOSI_U1, LORA_RESET_N, LORA_SCK_U1
MCU clocks reset and straps = PCB-MAIN_02_MCU.SchDoc: 3V3_DIGITAL, ACCEL_INT, BLE_EN, BLE_TX_U1, CELL_DTR_U16, CELL_RESET_N_CMD, CELL_RX_U16, CELL_TX_U16, EN_MODEM, GNSS_PPS_U1, GNSS_TX_U1, I2C2_SDA_U1, LORA_DIO1, LORA_MOSI_U1, LORA_RESET_N, LORA_SCK_U1, MIC_WAKE, NOR_IO0_U1, NOR_IO2_U1, NOR_NCS_U2, PDM_CLK, PDM_DATA2, PDM_DATA4, PWR_GOOD, REV_STRAP1, SD_CMD_U1, SD_D1_U1, SD_D3_U1, SIM1_DET, SIM_MUX_EN, SWCLK, TAMPER_IN_U1, TEST_UART_TX_U1, USB_DP_U1, AAD_CFG, BLE_DFU_REQ, BLE_RX_U1, BOOT0, CELL_PWRKEY_CMD, CELL_RI_U16, CELL_STATUS_U16, EN_AUX, GND_DIGITAL, GNSS_RX_U1, I2C2_SCL_U1, LORA_BUSY, LORA_MISO_U1, LORA_NSS_U1, LORA_RXEN, LORA_TXEN, NOR_CLK_U1, NOR_IO1_U1, NOR_IO3_U1, NRST, PDM_DATA1, PDM_DATA3, PWR_FAULT, REV_STRAP0, SD_CK_U1, SD_D0_U1, SD_D2_U1, SD_DET, SIM2_DET, SIM_MUX_SEL, SWDIO, TEST_UART_RX_U1, USB_DM_U1, USB_VBUS_SENSE
PDM audio AAD and microphone harnesses = PCB-MAIN_03_AUDIO.SchDoc: 1V8_MIC, AAD_CFG, GND_MIC, PDM_CLK, PDM_DATA2, PDM_DATA4, 3V3_DIGITAL, GND_DIGITAL, MIC_WAKE, PDM_DATA1, PDM_DATA3
Power entry and rail interface = PCB-MAIN_01_POWER.SchDoc: 1V8_MIC, 3V8_MODEM, EN_MODEM, GND_DIGITAL, GND_MODEM, I2C2_SDA_BUS, PWR_GOOD, 3V3_DIGITAL, EN_AUX, FAULT, GND_MIC, I2C2_SCL_BUS, PWR_FAULT
Storage sensors microSD and tamper = PCB-MAIN_08_STORAGE_SENSORS.SchDoc: 3V3_DIGITAL, GND_DIGITAL, I2C2_SCL_U1, I2C2_SDA_U1, NOR_IO0_U1, NOR_IO2_U1, NOR_NCS_U2, SD_CMD_U1, SD_D1_U1, SD_D3_U1, TAMPER_IN_U1, ACCEL_INT, I2C2_SCL_BUS, I2C2_SDA_BUS, NOR_CLK_U1, NOR_IO1_U1, NOR_IO3_U1, SD_CK_U1, SD_D0_U1, SD_D2_U1, SD_DET
USB service debug and EOL fixture = PCB-MAIN_09_CONNECTORS_TEST.SchDoc: 1V8_MIC, 3V8_MODEM, FAULT, I2C2_SCL_BUS, NRST, REV_STRAP0, SWCLK, TEST_UART_RX_U1, USB_DM_U1, USB_VBUS_SENSE, 3V3_DIGITAL, BOOT0, GND_DIGITAL, I2C2_SDA_BUS, PWR_GOOD, REV_STRAP1, SWDIO, TEST_UART_TX_U1, USB_DP_U1

## Nets
1V8_MIC: sheet Power entry and rail interface/1V8_MIC, sheet PDM audio AAD and microphone harnesses/1V8_MIC, sheet USB service debug and EOL fixture/1V8_MIC
3V3_DIGITAL: sheet Power entry and rail interface/3V3_DIGITAL, sheet MCU clocks reset and straps/3V3_DIGITAL, sheet PDM audio AAD and microphone harnesses/3V3_DIGITAL, sheet GNSS timing antenna and supervisor/3V3_DIGITAL, sheet Cellular modem dual SIM and recovery/3V3_DIGITAL, sheet LoRa radio control and conducted RF/3V3_DIGITAL, sheet BLE module reset DFU and SWD/3V3_DIGITAL, sheet Storage sensors microSD and tamper/3V3_DIGITAL, sheet USB service debug and EOL fixture/3V3_DIGITAL
3V8_MODEM: sheet Power entry and rail interface/3V8_MODEM, sheet Cellular modem dual SIM and recovery/3V8_MODEM, sheet USB service debug and EOL fixture/3V8_MODEM
AAD_CFG: sheet MCU clocks reset and straps/AAD_CFG, sheet PDM audio AAD and microphone harnesses/AAD_CFG
ACCEL_INT: sheet MCU clocks reset and straps/ACCEL_INT, sheet Storage sensors microSD and tamper/ACCEL_INT
BLE_DFU_REQ: sheet MCU clocks reset and straps/BLE_DFU_REQ, sheet BLE module reset DFU and SWD/BLE_DFU_REQ
BLE_EN: sheet MCU clocks reset and straps/BLE_EN, sheet BLE module reset DFU and SWD/BLE_EN
BLE_RX_U1: sheet MCU clocks reset and straps/BLE_RX_U1, sheet BLE module reset DFU and SWD/BLE_RX_U1
BLE_TX_U1: sheet MCU clocks reset and straps/BLE_TX_U1, sheet BLE module reset DFU and SWD/BLE_TX_U1
BOOT0: sheet MCU clocks reset and straps/BOOT0, sheet USB service debug and EOL fixture/BOOT0
CELL_DTR_U16: sheet MCU clocks reset and straps/CELL_DTR_U16, sheet Cellular modem dual SIM and recovery/CELL_DTR_U16
CELL_PWRKEY_CMD: sheet MCU clocks reset and straps/CELL_PWRKEY_CMD, sheet Cellular modem dual SIM and recovery/CELL_PWRKEY_CMD
CELL_RESET_N_CMD: sheet MCU clocks reset and straps/CELL_RESET_N_CMD, sheet Cellular modem dual SIM and recovery/CELL_RESET_N_CMD
CELL_RI_U16: sheet MCU clocks reset and straps/CELL_RI_U16, sheet Cellular modem dual SIM and recovery/CELL_RI_U16
CELL_RX_U16: sheet MCU clocks reset and straps/CELL_RX_U16, sheet Cellular modem dual SIM and recovery/CELL_RX_U16
CELL_STATUS_U16: sheet MCU clocks reset and straps/CELL_STATUS_U16, sheet Cellular modem dual SIM and recovery/CELL_STATUS_U16
CELL_TX_U16: sheet MCU clocks reset and straps/CELL_TX_U16, sheet Cellular modem dual SIM and recovery/CELL_TX_U16
EN_AUX: sheet Power entry and rail interface/EN_AUX, sheet MCU clocks reset and straps/EN_AUX
EN_MODEM: sheet Power entry and rail interface/EN_MODEM, sheet MCU clocks reset and straps/EN_MODEM
FAULT: sheet Power entry and rail interface/FAULT, sheet USB service debug and EOL fixture/FAULT
GND_DIGITAL: sheet Power entry and rail interface/GND_DIGITAL, sheet MCU clocks reset and straps/GND_DIGITAL, sheet PDM audio AAD and microphone harnesses/GND_DIGITAL, sheet GNSS timing antenna and supervisor/GND_DIGITAL, sheet LoRa radio control and conducted RF/GND_DIGITAL, sheet BLE module reset DFU and SWD/GND_DIGITAL, sheet Storage sensors microSD and tamper/GND_DIGITAL, sheet USB service debug and EOL fixture/GND_DIGITAL
GND_MIC: sheet Power entry and rail interface/GND_MIC, sheet PDM audio AAD and microphone harnesses/GND_MIC
GND_MODEM: sheet Power entry and rail interface/GND_MODEM, sheet Cellular modem dual SIM and recovery/GND_MODEM
GNSS_PPS_U1: sheet MCU clocks reset and straps/GNSS_PPS_U1, sheet GNSS timing antenna and supervisor/GNSS_PPS_U1
GNSS_RX_U1: sheet MCU clocks reset and straps/GNSS_RX_U1, sheet GNSS timing antenna and supervisor/GNSS_RX_U1
GNSS_TX_U1: sheet MCU clocks reset and straps/GNSS_TX_U1, sheet GNSS timing antenna and supervisor/GNSS_TX_U1
I2C2_SCL_BUS: sheet Power entry and rail interface/I2C2_SCL_BUS, sheet Storage sensors microSD and tamper/I2C2_SCL_BUS, sheet USB service debug and EOL fixture/I2C2_SCL_BUS
I2C2_SCL_U1: sheet MCU clocks reset and straps/I2C2_SCL_U1, sheet Storage sensors microSD and tamper/I2C2_SCL_U1
I2C2_SDA_BUS: sheet Power entry and rail interface/I2C2_SDA_BUS, sheet Storage sensors microSD and tamper/I2C2_SDA_BUS, sheet USB service debug and EOL fixture/I2C2_SDA_BUS
I2C2_SDA_U1: sheet MCU clocks reset and straps/I2C2_SDA_U1, sheet Storage sensors microSD and tamper/I2C2_SDA_U1
LORA_BUSY: sheet MCU clocks reset and straps/LORA_BUSY, sheet LoRa radio control and conducted RF/LORA_BUSY
LORA_DIO1: sheet MCU clocks reset and straps/LORA_DIO1, sheet LoRa radio control and conducted RF/LORA_DIO1
LORA_MISO_U1: sheet MCU clocks reset and straps/LORA_MISO_U1, sheet LoRa radio control and conducted RF/LORA_MISO_U1
LORA_MOSI_U1: sheet MCU clocks reset and straps/LORA_MOSI_U1, sheet LoRa radio control and conducted RF/LORA_MOSI_U1
LORA_NSS_U1: sheet MCU clocks reset and straps/LORA_NSS_U1, sheet LoRa radio control and conducted RF/LORA_NSS_U1
LORA_RESET_N: sheet MCU clocks reset and straps/LORA_RESET_N, sheet LoRa radio control and conducted RF/LORA_RESET_N
LORA_RXEN: sheet MCU clocks reset and straps/LORA_RXEN, sheet LoRa radio control and conducted RF/LORA_RXEN
LORA_SCK_U1: sheet MCU clocks reset and straps/LORA_SCK_U1, sheet LoRa radio control and conducted RF/LORA_SCK_U1
LORA_TXEN: sheet MCU clocks reset and straps/LORA_TXEN, sheet LoRa radio control and conducted RF/LORA_TXEN
MIC_WAKE: sheet MCU clocks reset and straps/MIC_WAKE, sheet PDM audio AAD and microphone harnesses/MIC_WAKE
NOR_CLK_U1: sheet MCU clocks reset and straps/NOR_CLK_U1, sheet Storage sensors microSD and tamper/NOR_CLK_U1
NOR_IO0_U1: sheet MCU clocks reset and straps/NOR_IO0_U1, sheet Storage sensors microSD and tamper/NOR_IO0_U1
NOR_IO1_U1: sheet MCU clocks reset and straps/NOR_IO1_U1, sheet Storage sensors microSD and tamper/NOR_IO1_U1
NOR_IO2_U1: sheet MCU clocks reset and straps/NOR_IO2_U1, sheet Storage sensors microSD and tamper/NOR_IO2_U1
NOR_IO3_U1: sheet MCU clocks reset and straps/NOR_IO3_U1, sheet Storage sensors microSD and tamper/NOR_IO3_U1
NOR_NCS_U2: sheet MCU clocks reset and straps/NOR_NCS_U2, sheet Storage sensors microSD and tamper/NOR_NCS_U2
NRST: sheet MCU clocks reset and straps/NRST, sheet USB service debug and EOL fixture/NRST
PDM_CLK: sheet MCU clocks reset and straps/PDM_CLK, sheet PDM audio AAD and microphone harnesses/PDM_CLK
PDM_DATA1: sheet MCU clocks reset and straps/PDM_DATA1, sheet PDM audio AAD and microphone harnesses/PDM_DATA1
PDM_DATA2: sheet MCU clocks reset and straps/PDM_DATA2, sheet PDM audio AAD and microphone harnesses/PDM_DATA2
PDM_DATA3: sheet MCU clocks reset and straps/PDM_DATA3, sheet PDM audio AAD and microphone harnesses/PDM_DATA3
PDM_DATA4: sheet MCU clocks reset and straps/PDM_DATA4, sheet PDM audio AAD and microphone harnesses/PDM_DATA4
PWR_FAULT: sheet Power entry and rail interface/PWR_FAULT, sheet MCU clocks reset and straps/PWR_FAULT
PWR_GOOD: sheet Power entry and rail interface/PWR_GOOD, sheet MCU clocks reset and straps/PWR_GOOD, sheet USB service debug and EOL fixture/PWR_GOOD
REV_STRAP0: sheet MCU clocks reset and straps/REV_STRAP0, sheet USB service debug and EOL fixture/REV_STRAP0
REV_STRAP1: sheet MCU clocks reset and straps/REV_STRAP1, sheet USB service debug and EOL fixture/REV_STRAP1
SD_CK_U1: sheet MCU clocks reset and straps/SD_CK_U1, sheet Storage sensors microSD and tamper/SD_CK_U1
SD_CMD_U1: sheet MCU clocks reset and straps/SD_CMD_U1, sheet Storage sensors microSD and tamper/SD_CMD_U1
SD_D0_U1: sheet MCU clocks reset and straps/SD_D0_U1, sheet Storage sensors microSD and tamper/SD_D0_U1
SD_D1_U1: sheet MCU clocks reset and straps/SD_D1_U1, sheet Storage sensors microSD and tamper/SD_D1_U1
SD_D2_U1: sheet MCU clocks reset and straps/SD_D2_U1, sheet Storage sensors microSD and tamper/SD_D2_U1
SD_D3_U1: sheet MCU clocks reset and straps/SD_D3_U1, sheet Storage sensors microSD and tamper/SD_D3_U1
SD_DET: sheet MCU clocks reset and straps/SD_DET, sheet Storage sensors microSD and tamper/SD_DET
SIM1_DET: sheet MCU clocks reset and straps/SIM1_DET, sheet Cellular modem dual SIM and recovery/SIM1_DET
SIM2_DET: sheet MCU clocks reset and straps/SIM2_DET, sheet Cellular modem dual SIM and recovery/SIM2_DET
SIM_MUX_EN: sheet MCU clocks reset and straps/SIM_MUX_EN, sheet Cellular modem dual SIM and recovery/SIM_MUX_EN
SIM_MUX_SEL: sheet MCU clocks reset and straps/SIM_MUX_SEL, sheet Cellular modem dual SIM and recovery/SIM_MUX_SEL
SWCLK: sheet MCU clocks reset and straps/SWCLK, sheet USB service debug and EOL fixture/SWCLK
SWDIO: sheet MCU clocks reset and straps/SWDIO, sheet USB service debug and EOL fixture/SWDIO
TAMPER_IN_U1: sheet MCU clocks reset and straps/TAMPER_IN_U1, sheet Storage sensors microSD and tamper/TAMPER_IN_U1
TEST_UART_RX_U1: sheet MCU clocks reset and straps/TEST_UART_RX_U1, sheet USB service debug and EOL fixture/TEST_UART_RX_U1
TEST_UART_TX_U1: sheet MCU clocks reset and straps/TEST_UART_TX_U1, sheet USB service debug and EOL fixture/TEST_UART_TX_U1
USB_DM_U1: sheet MCU clocks reset and straps/USB_DM_U1, sheet USB service debug and EOL fixture/USB_DM_U1
USB_DP_U1: sheet MCU clocks reset and straps/USB_DP_U1, sheet USB service debug and EOL fixture/USB_DP_U1
USB_VBUS_SENSE: sheet MCU clocks reset and straps/USB_VBUS_SENSE, sheet USB service debug and EOL fixture/USB_VBUS_SENSE

## Notes on the sheet
- Hierarchy-only engineering candidate. Signed Review-A pin/net authority is retained; routing, DRC, DFM, Review B and manufacture remain prohibited.
- Sheet: Power entry and rail interface
- Sheet: GNSS timing antenna and supervisor
- Sheet: BLE module reset DFU and SWD
- File: PCB-MAIN_01_POWER.kicad_sch.sch
- File: PCB-MAIN_04_GNSS.kicad_sch.sch
- File: PCB-MAIN_07_BLE.kicad_sch.sch
- Sheet: MCU clocks reset and straps
- Sheet: Cellular modem dual SIM and recovery
- Sheet: Storage sensors microSD and tamper
- File: PCB-MAIN_02_MCU.kicad_sch.sch
- File: PCB-MAIN_05_CELLULAR.kicad_sch.sch
- File: PCB-MAIN_08_STORAGE_SENSORS.kicad_sch.sch
- Sheet: PDM audio AAD and microphone harnesses
- Sheet: LoRa radio control and conducted RF
- Sheet: USB service debug and EOL fixture
- File: PCB-MAIN_03_AUDIO.kicad_sch.sch
- File: PCB-MAIN_06_LORA.kicad_sch.sch
- File: PCB-MAIN_09_CONNECTORS_TEST.kicad_sch.sch
- 1
- 2
- 3
- 4
- 5
- 6
- 7
- 8
- 9
- 10
- 11
- A
- B
- C
- D
- E
- F
- G
- H
- Human-readable hierarchy candidate; exact Review-A pin/net equivalence enforced
- Root sheet 1 of 10
- NOT FOR MANUFACTURE - hierarchy review/routing/DRC/DFM/Review B pending
- Title: Dioneya PCB-MAIN Rev.A - System overview
- File: PCB-MAIN.kicad_sch
- Sheet: /
- Dioneya / ZS-BPLA
- KiCad E.D.A.  kicad (5.1.4)-1
- Size: A2
- Date: 2026-09-16
- Rev: A
- Id: 1/1